# Altium schematic sheet Bang-Bang滞回控制.SchDoc
size 1651 x 1651 mm; SheetNumber: 9; SheetTotal: 16
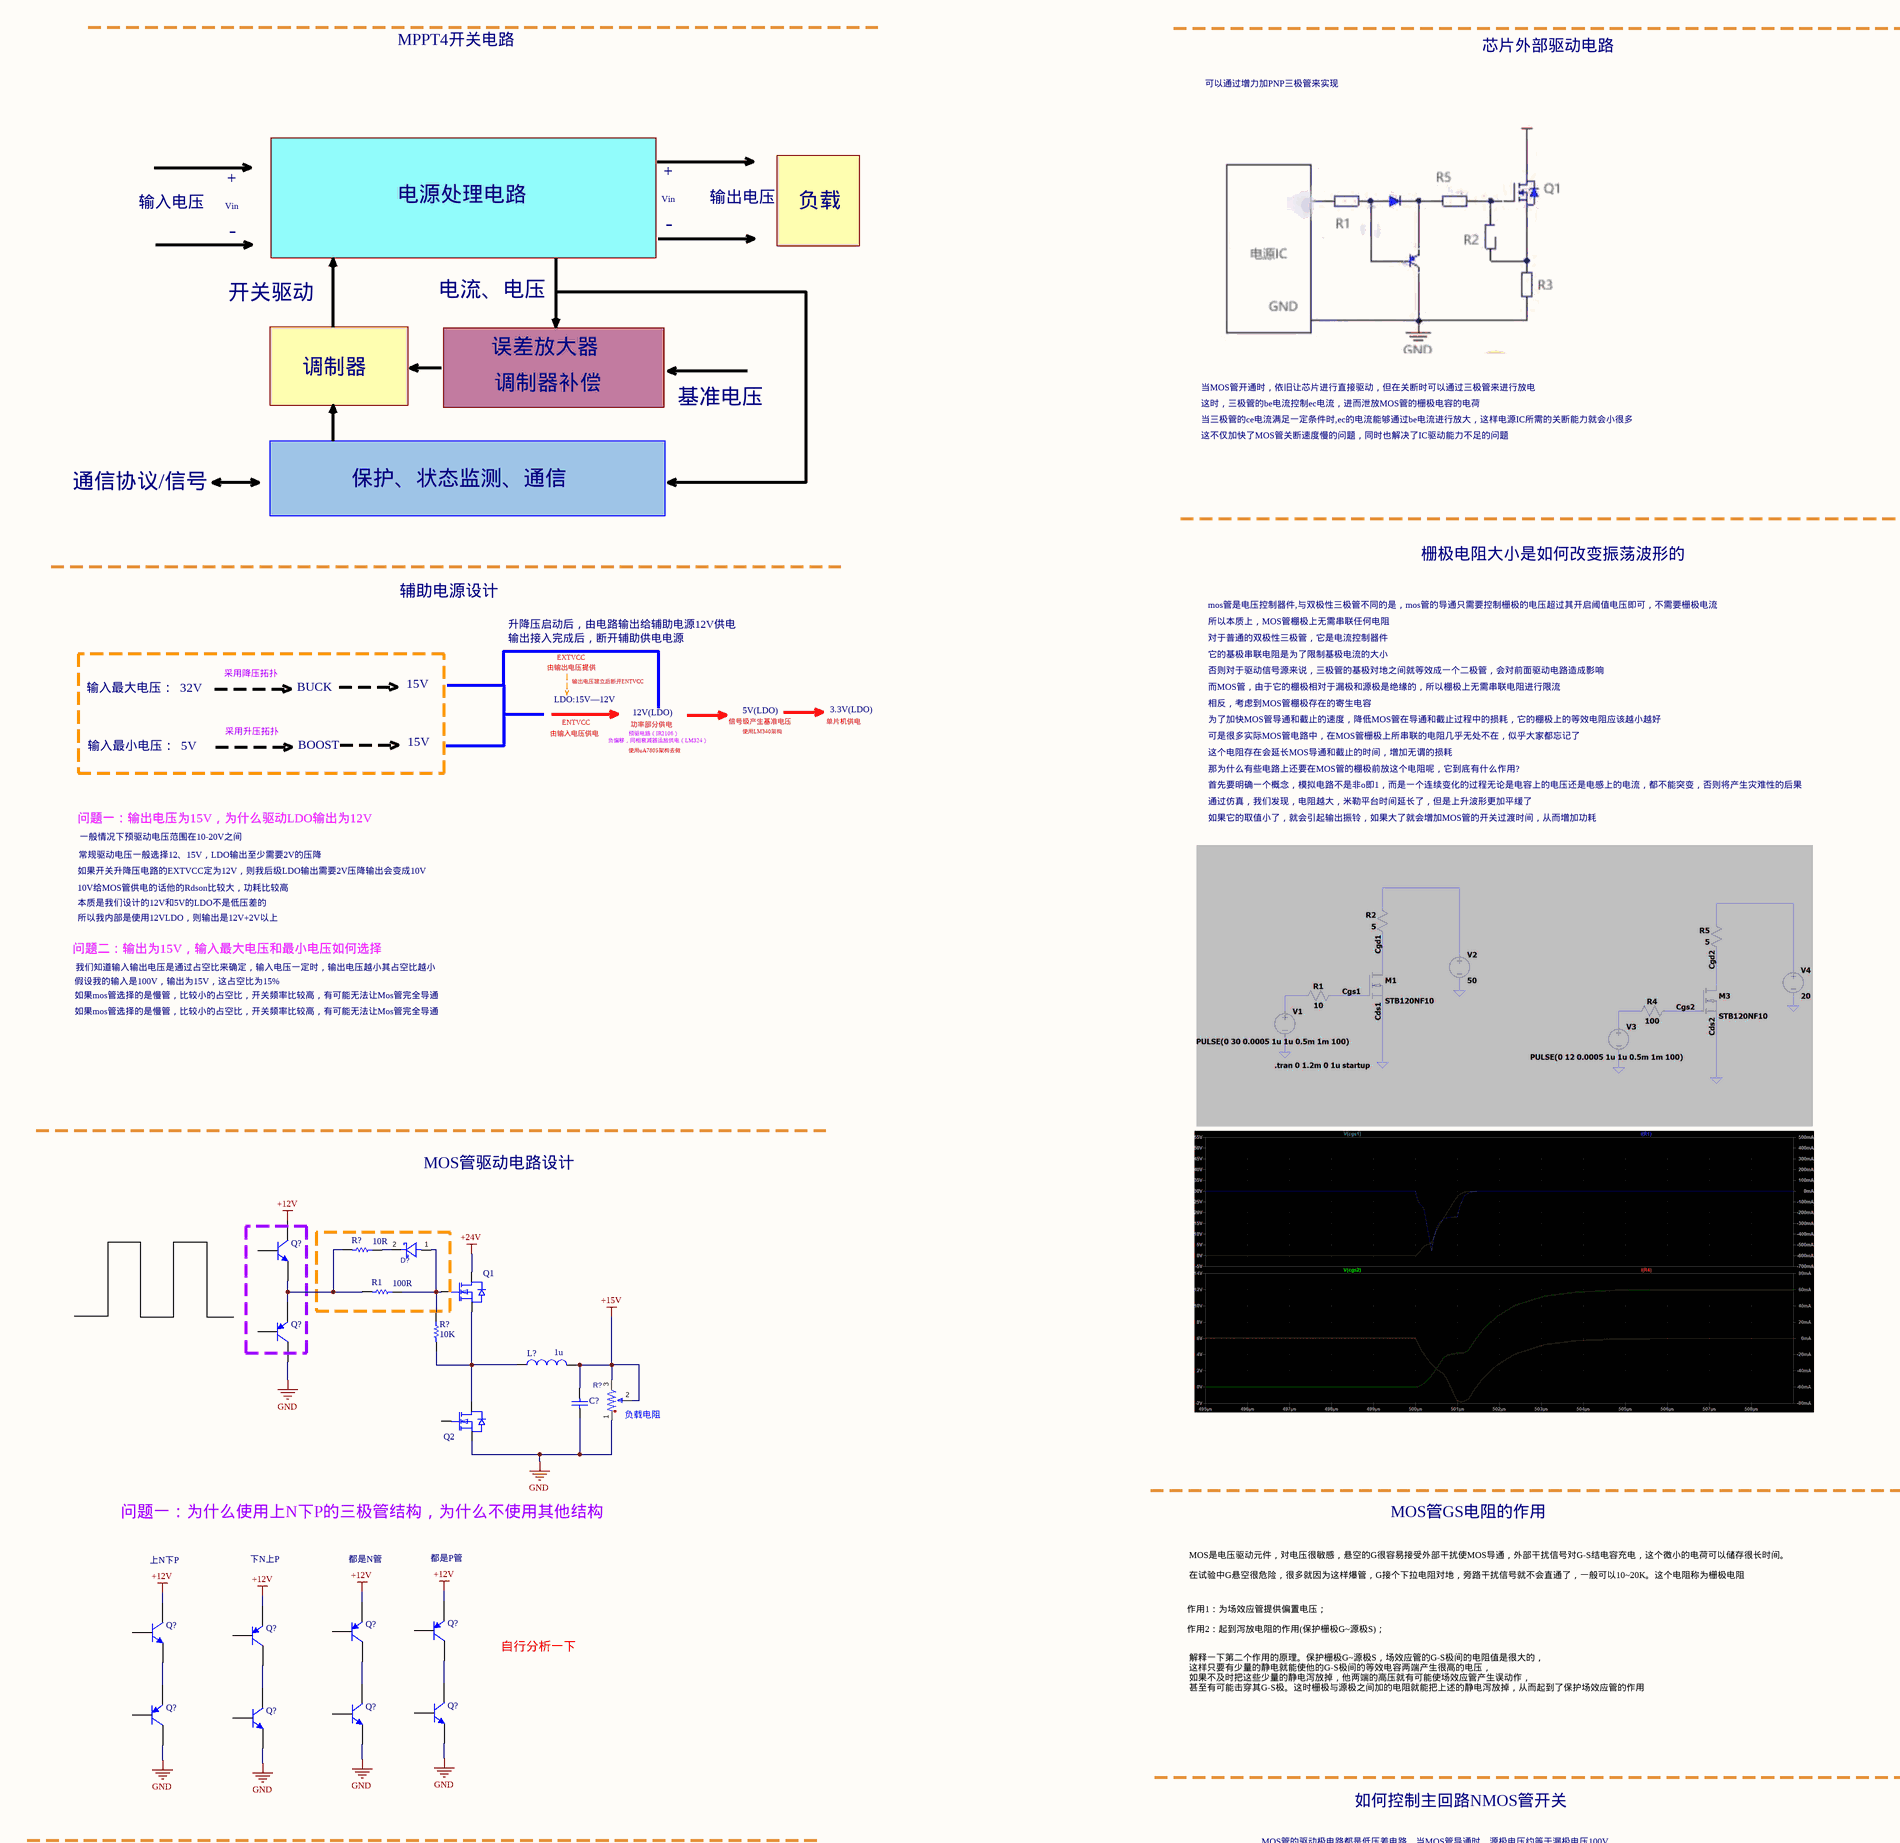
[diagram p0: Bang-Bang滞回控制.SchDoc, top left]
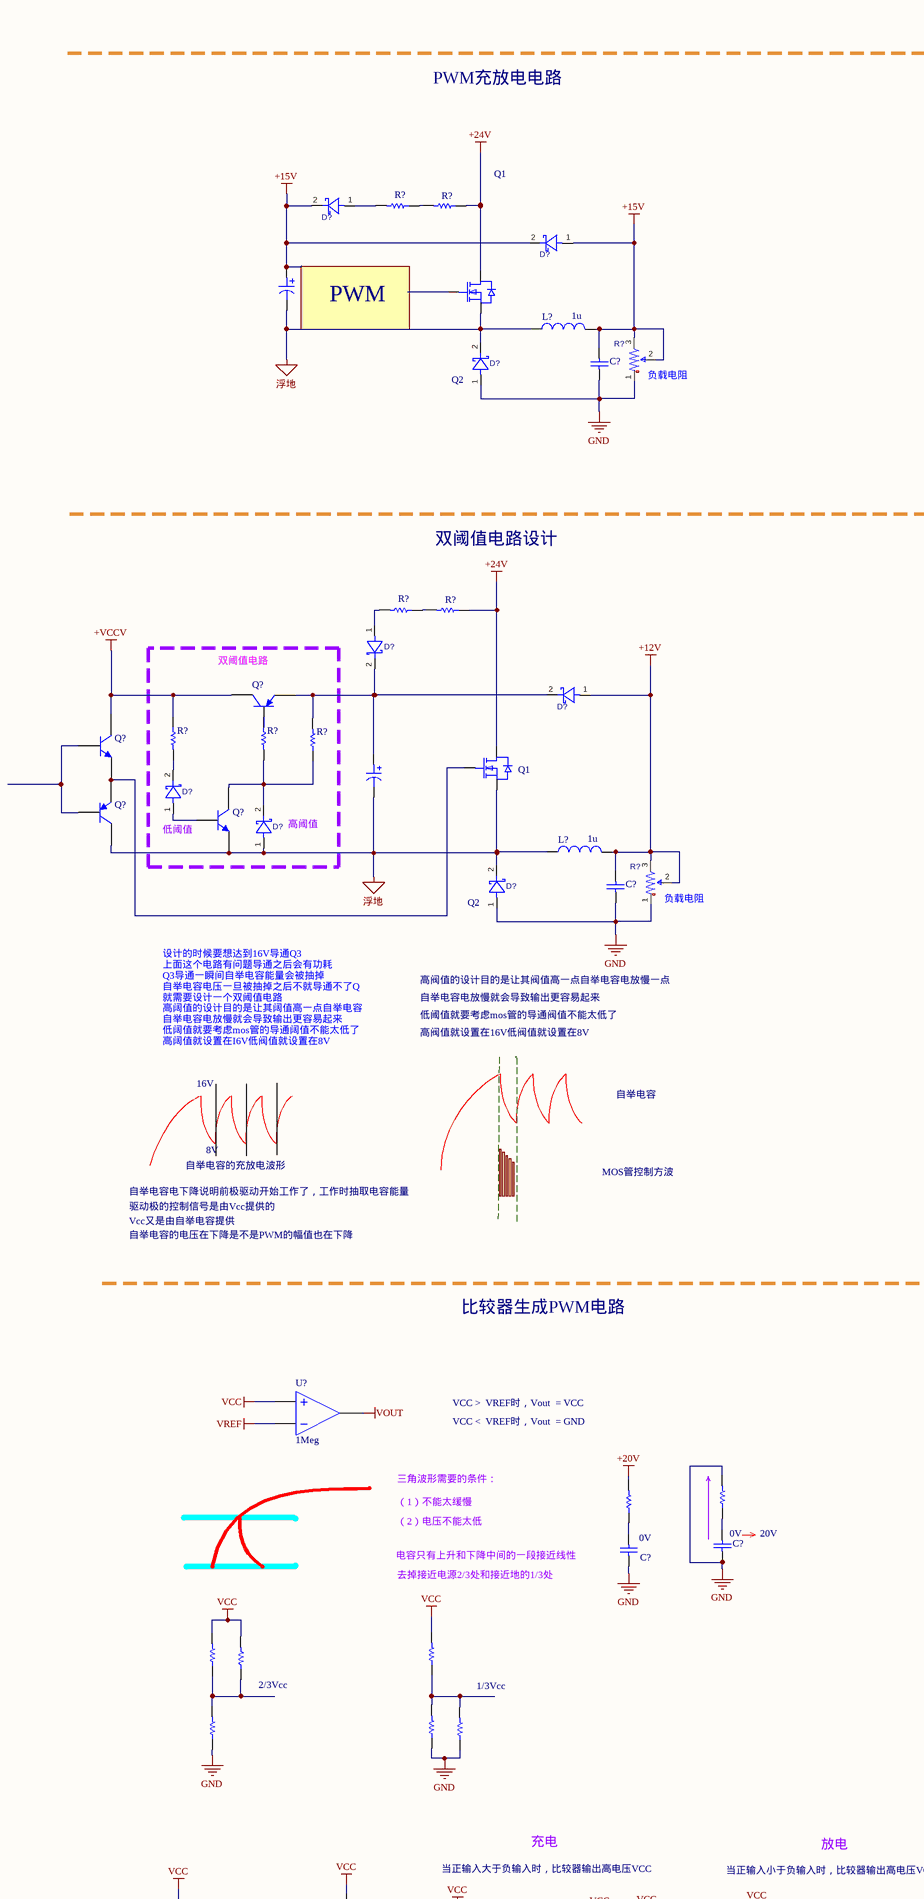
[diagram p1: Bang-Bang滞回控制.SchDoc, top middle]
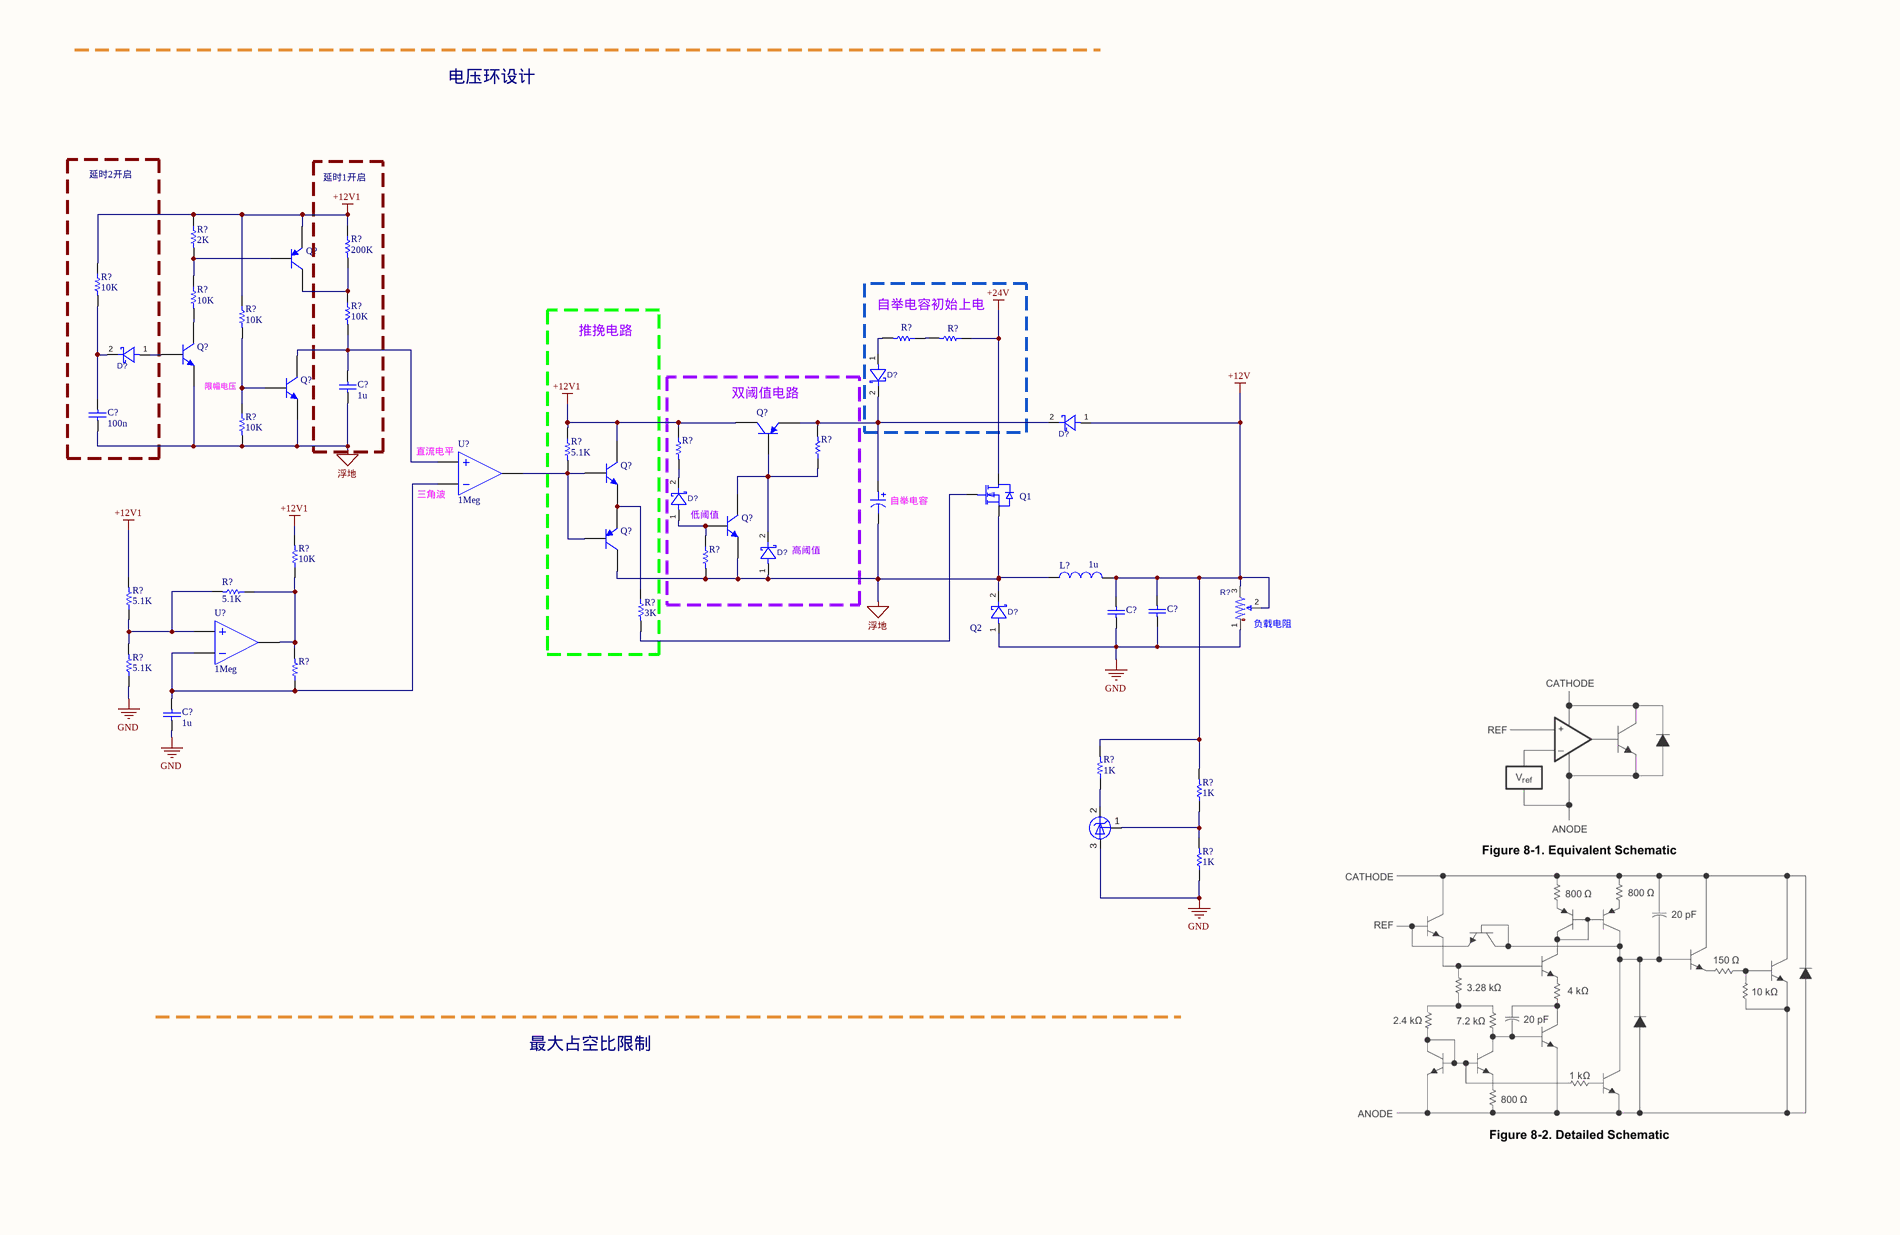
[diagram p2: Bang-Bang滞回控制.SchDoc, top right]
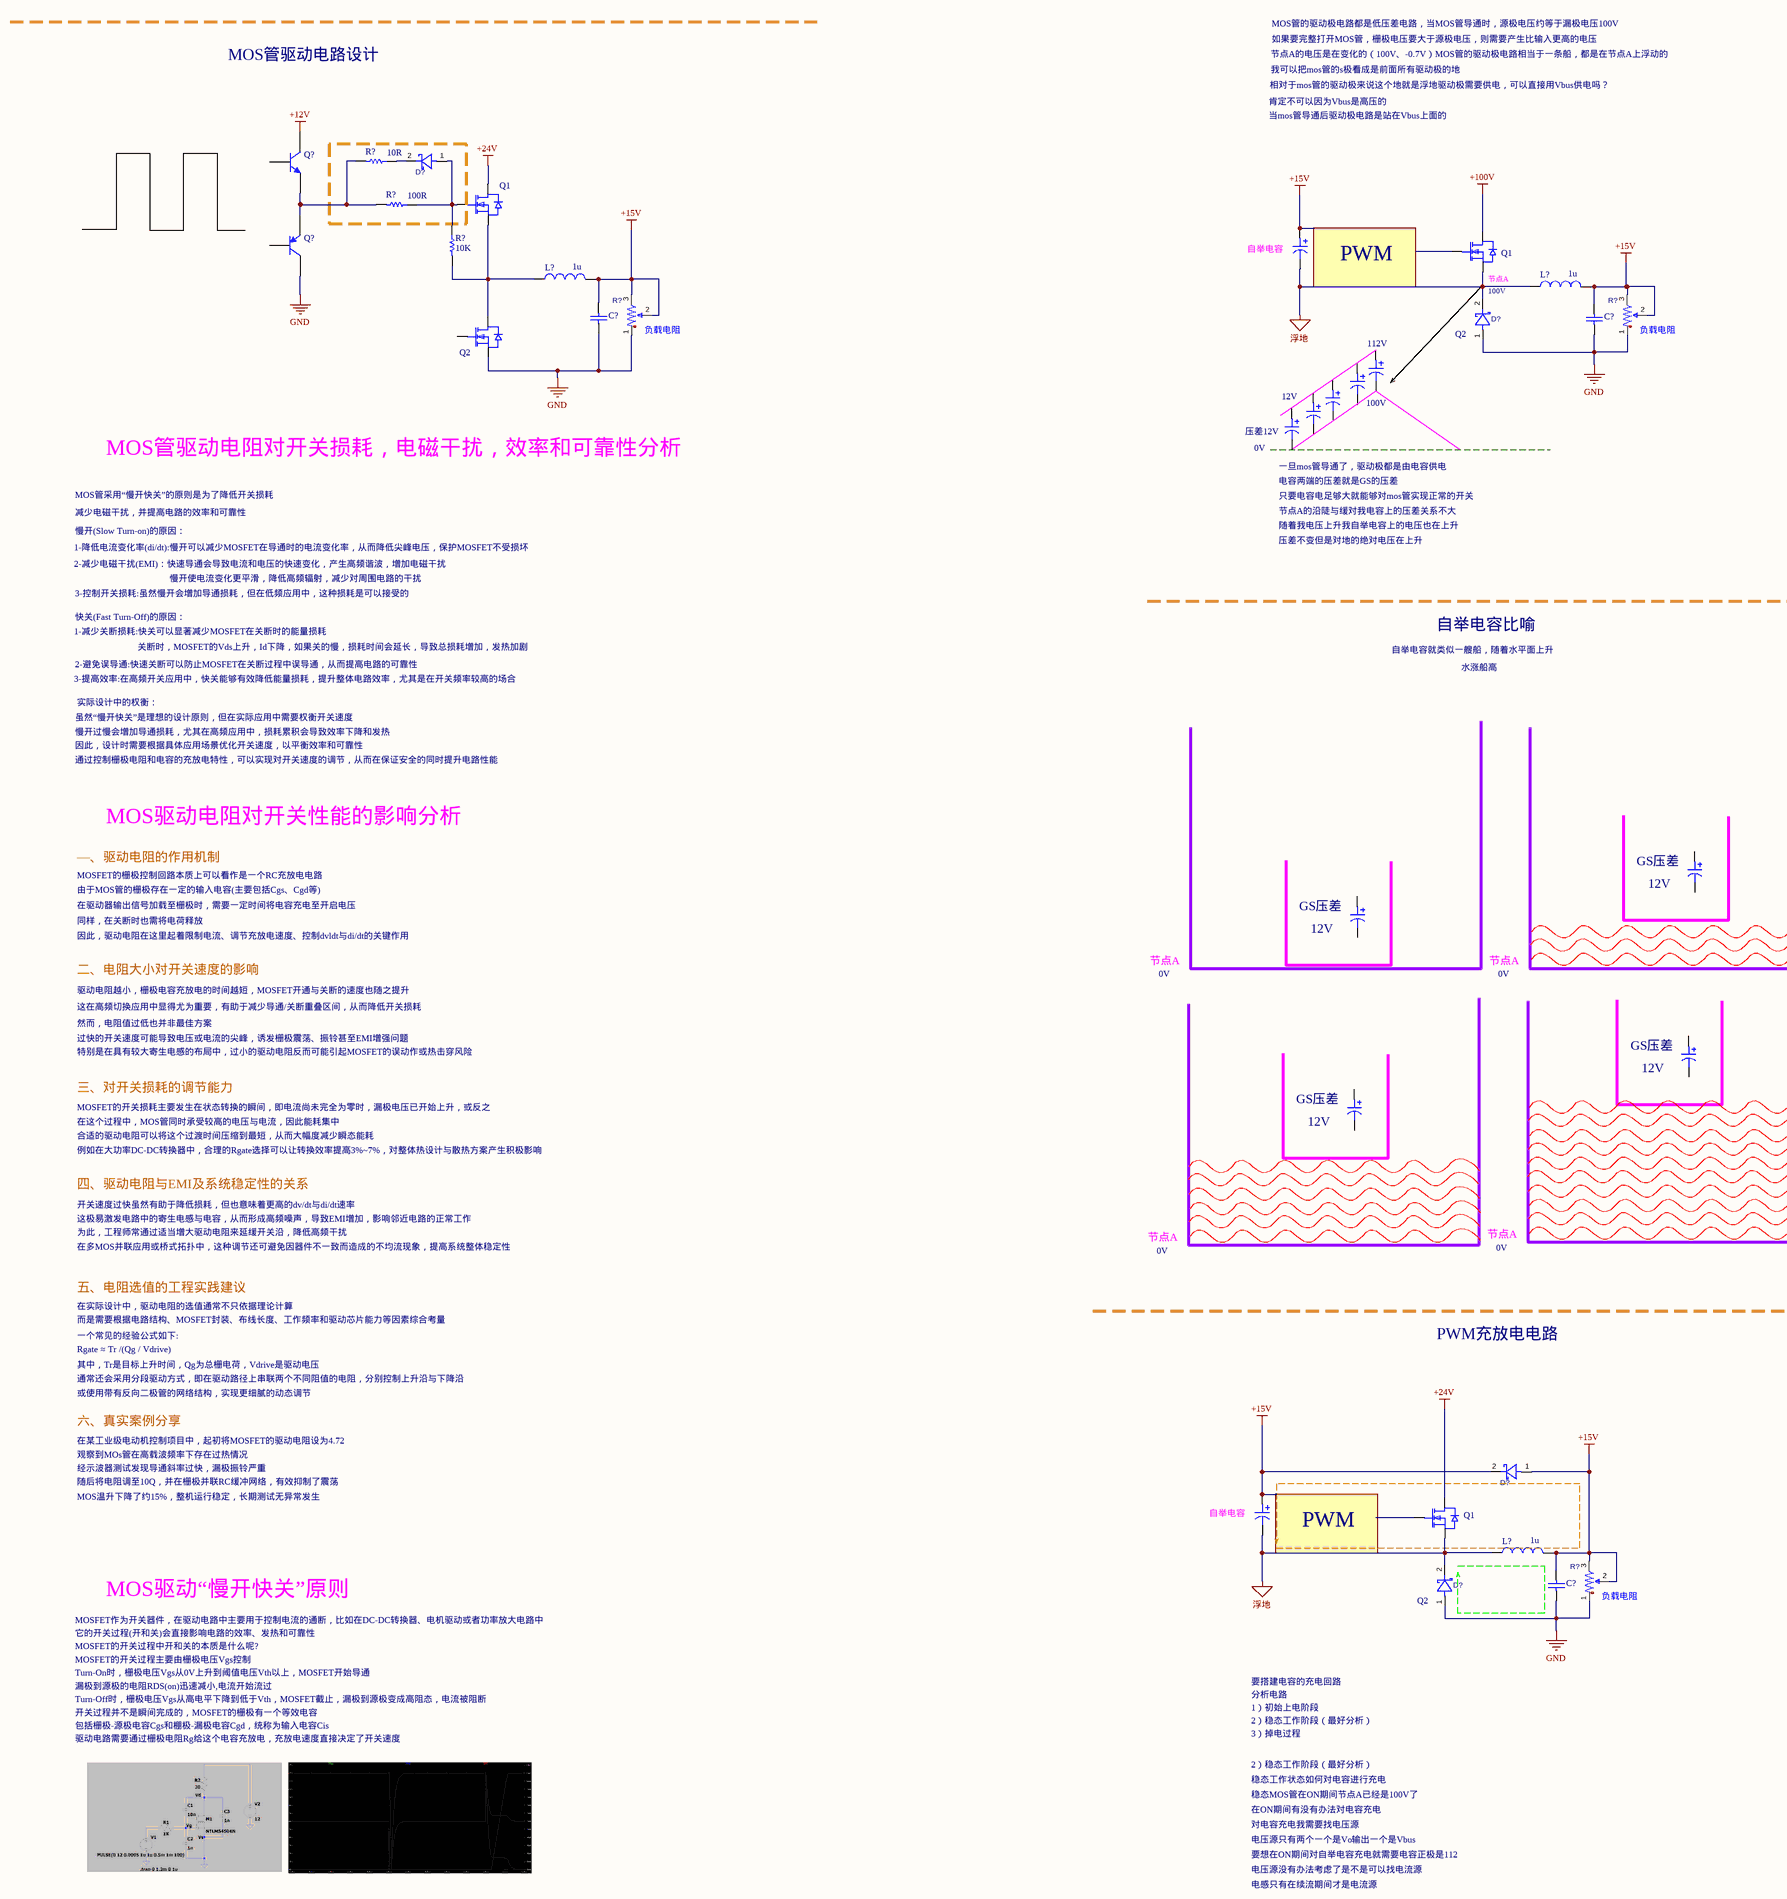
[diagram p3: Bang-Bang滞回控制.SchDoc, centre left]
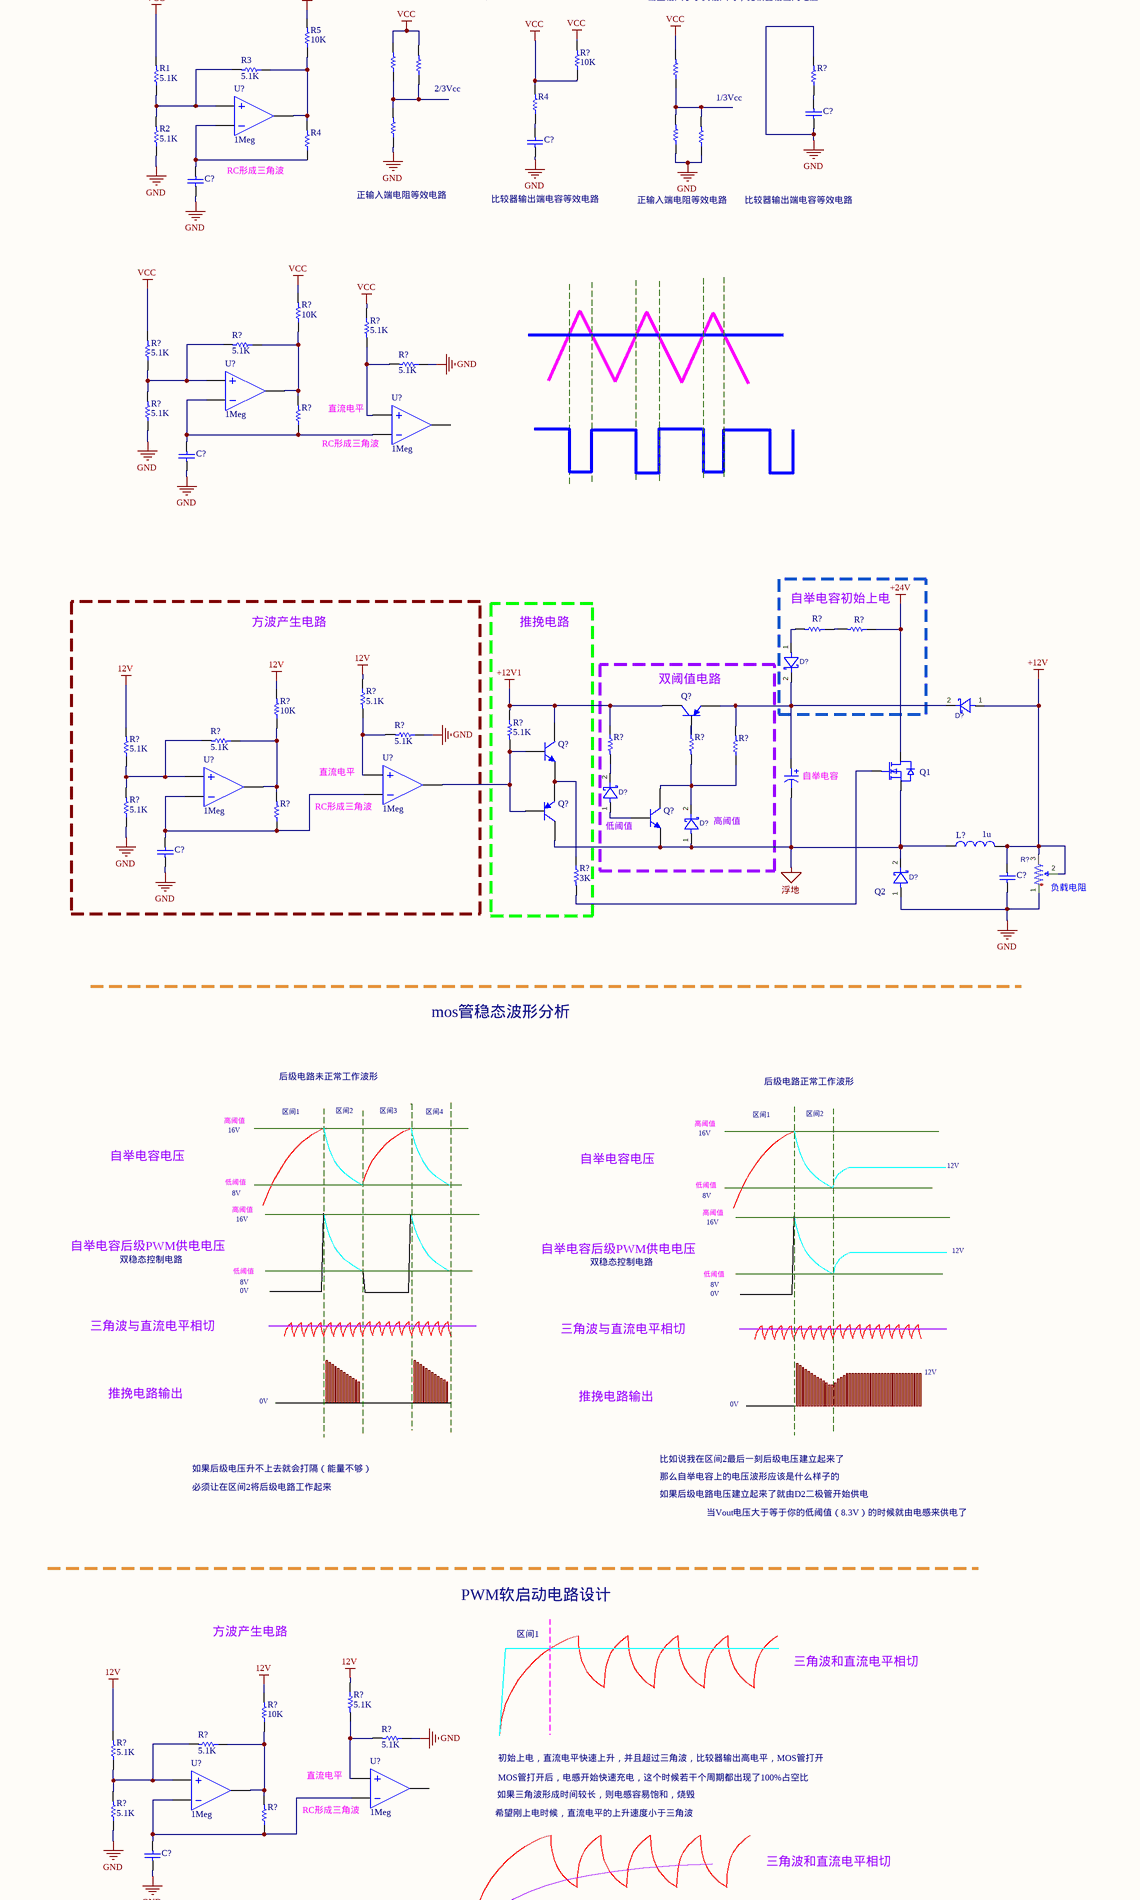
[diagram p4: Bang-Bang滞回控制.SchDoc, centre middle]
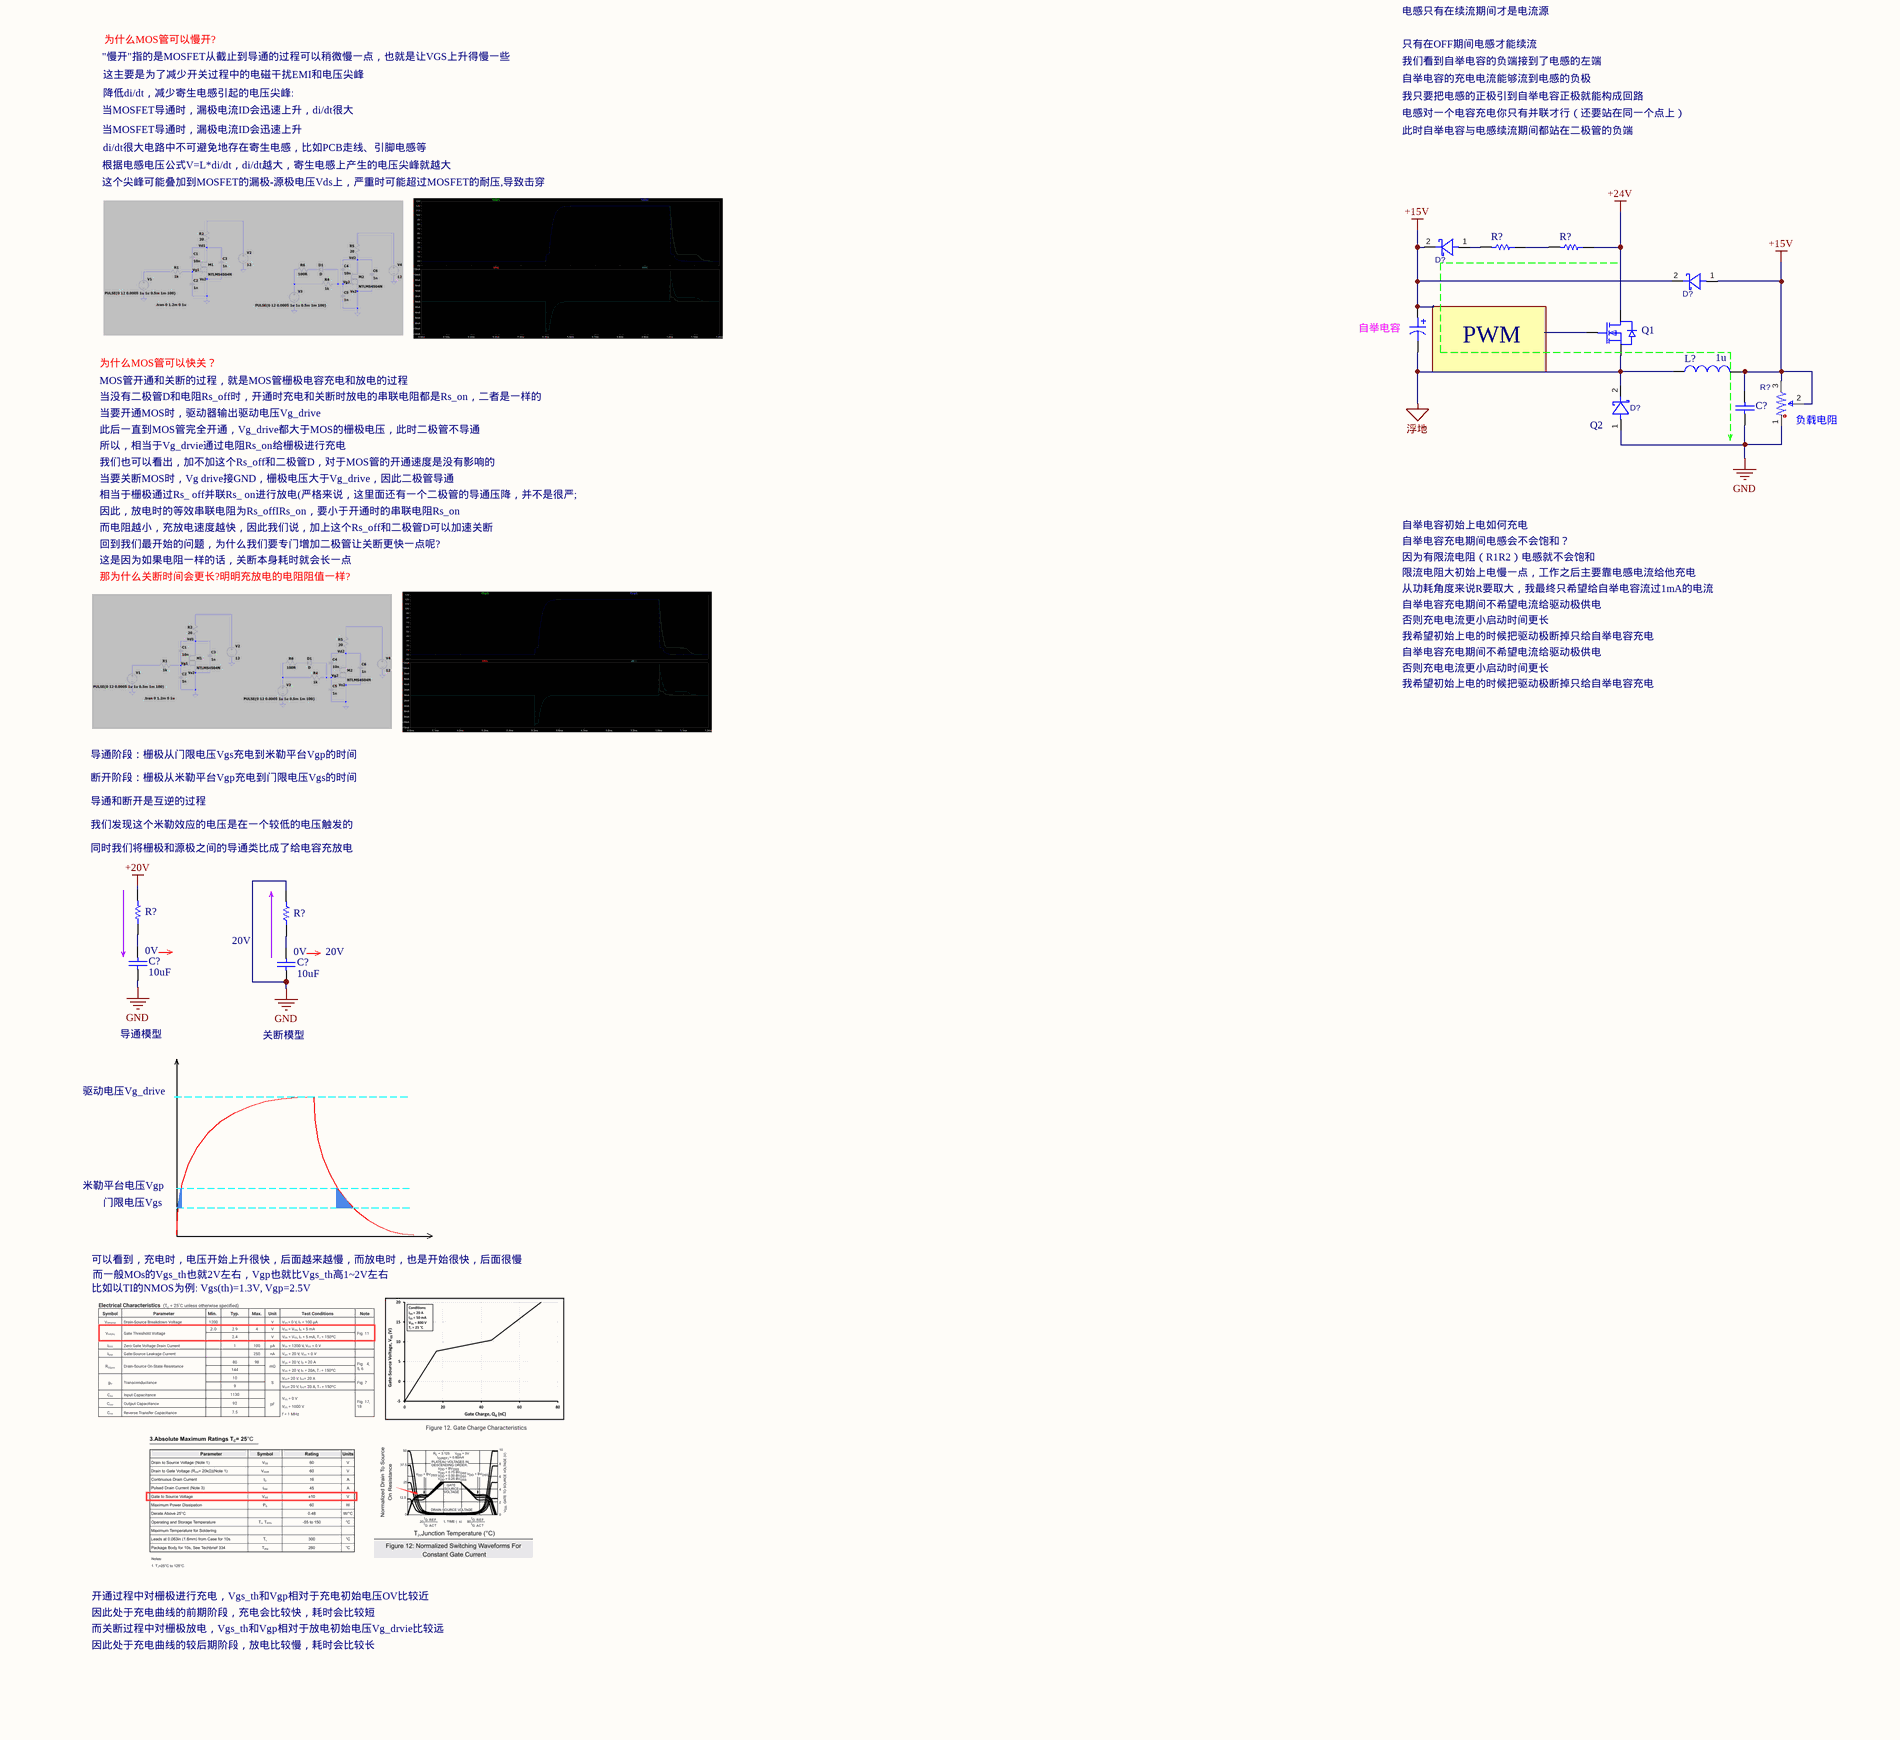
[diagram p5: Bang-Bang滞回控制.SchDoc, bottom left]
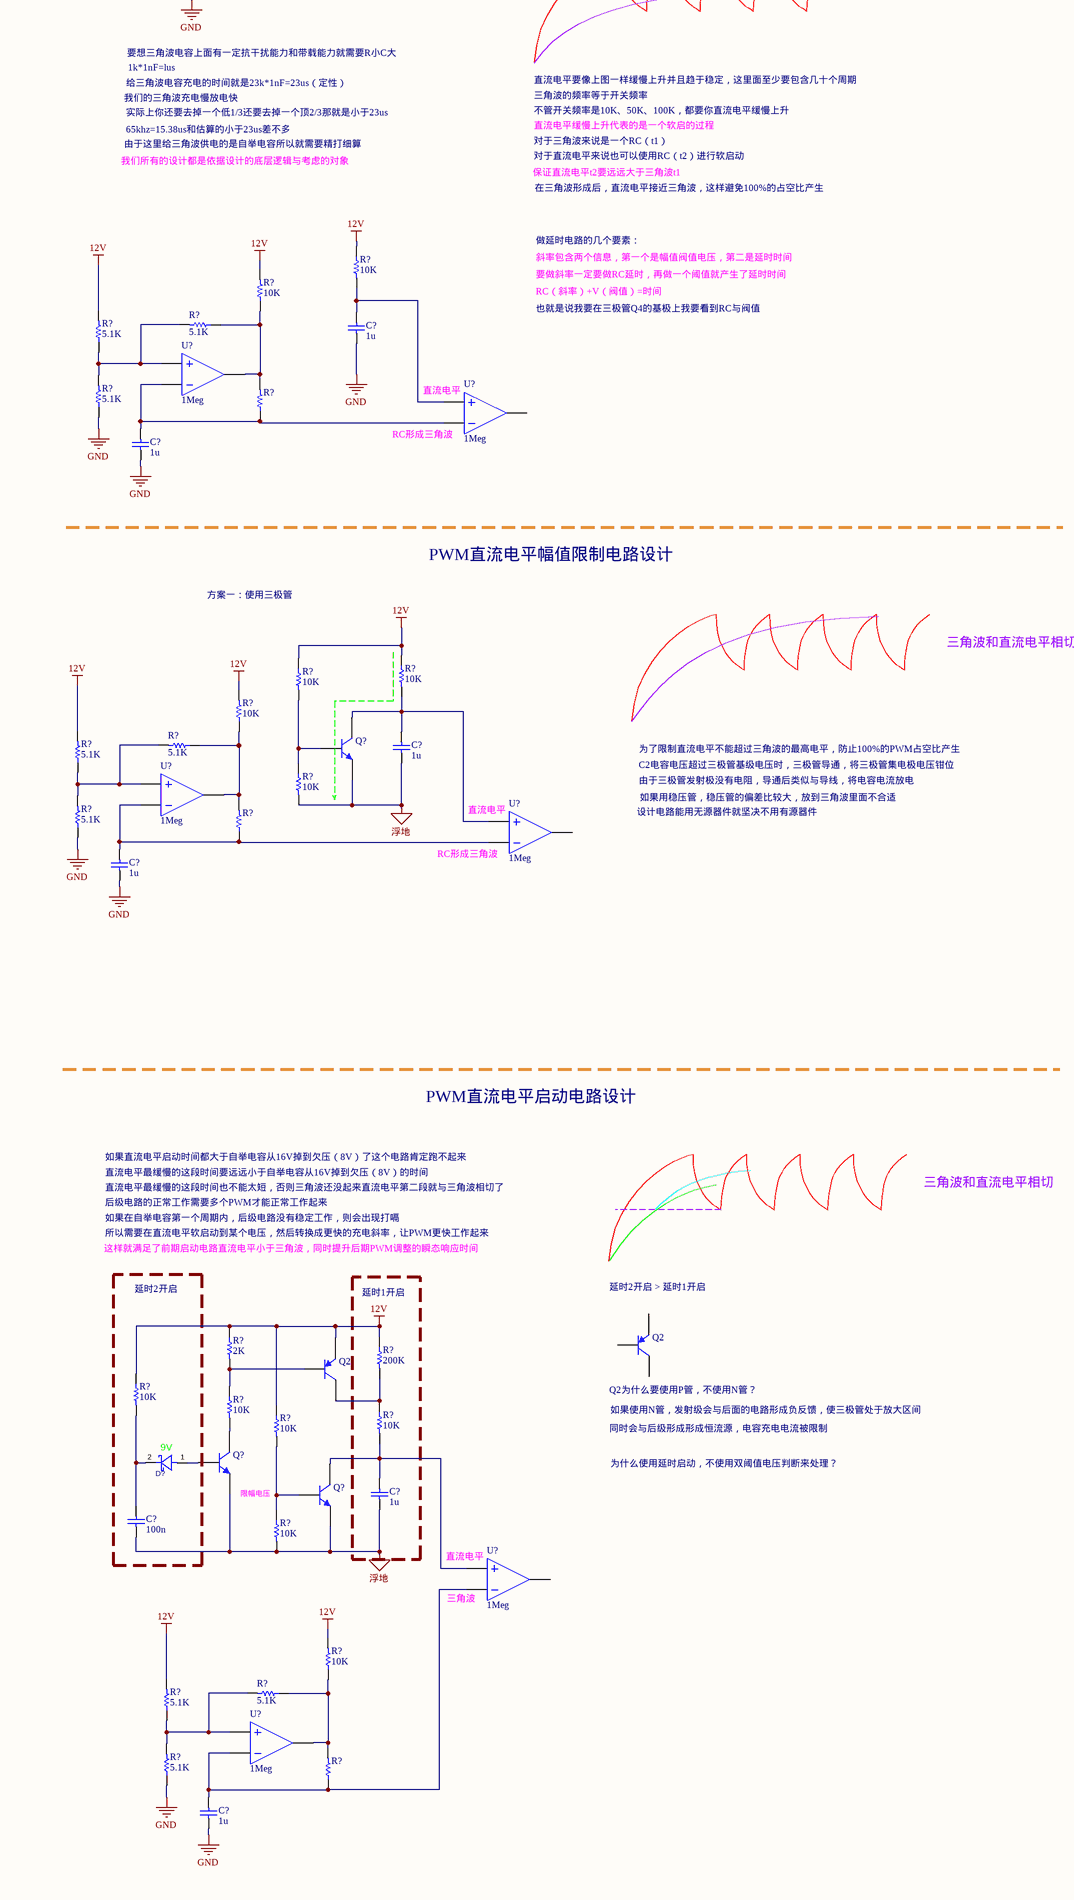
[diagram p6: Bang-Bang滞回控制.SchDoc, bottom middle]

## Parts
(Parts that share a designator on the sheet are numbered #1, #2 ... from top to bottom, then left to right.)
C?#1  JVJ50V100M6X8  (value not drawn)
C?#2  Capacitor  (value not drawn)
C?#3  value 1u  (hidden comment: Capacitor)
C?#4  value 100n  (hidden comment: Capacitor)
C?#5  JVJ50V100M6X8  (value not drawn)
C?#6  Capacitor  (value not drawn)
C?#7  Capacitor  (value not drawn)
C?#8  value 1u  (hidden comment: Capacitor)
C?#9  JVJ50V100M6X8  (value not drawn)
C?#10  Capacitor  (value not drawn)
C?#11  Capacitor  (value not drawn)
C?#12  Capacitor  (value not drawn)
C?#13  Capacitor  (value not drawn)
C?#14  Capacitor  (value not drawn)
C?#15  Capacitor  (value not drawn)
C?#16  Capacitor  (value not drawn)
C?#17  JVJ50V100M6X8  (value not drawn)
C?#18  Capacitor  (value not drawn)
C?#19  Capacitor  (value not drawn)
C?#20  JVJ50V100M6X8  (value not drawn)
C?#21  JVJ50V100M6X8  (value not drawn)
C?#22  JVJ50V100M6X8  (value not drawn)
C?#23  JVJ50V100M6X8  (value not drawn)
C?#24  Capacitor  (value not drawn)
C?#25  JVJ50V100M6X8  (value not drawn)
C?#26  JVJ50V100M6X8  (value not drawn)
C?#27  Capacitor  (value not drawn)
C?#28  Capacitor  (value not drawn)
C?#29  JVJ50V100M6X8  (value not drawn)
C?#30  JVJ50V100M6X8  (value not drawn)
C?#31  JVJ50V100M6X8  (value not drawn)
C?#32  JVJ50V100M6X8  (value not drawn)
C?#33  JVJ50V100M6X8  (value not drawn)
C?#34  Capacitor  (value not drawn)
C?#35  Capacitor  (value not drawn)
C?#36  JVJ50V100M6X8  (value not drawn)
C?#37  value 1u  (hidden comment: Capacitor)
C?#38  Capacitor  (value not drawn)
C?#39  value 1u  (hidden comment: Capacitor)
C?#40  value 1u  (hidden comment: Capacitor)
C?#41  value 1u  (hidden comment: Capacitor)
C?#42  value 10uF  (hidden comment: Capacitor)
C?#43  value 10uF  (hidden comment: Capacitor)
C?#44  value 1u  (hidden comment: Capacitor)
C?#45  value 100n  (hidden comment: Capacitor)
C?#46  value 1u  (hidden comment: Capacitor)
D?#1  15V  (value not drawn)
D?#2  15V  (value not drawn)
D?#3  15V  (value not drawn)
D?#4  15V  (value not drawn)
D?#5  15V  (value not drawn)
D?#6  15V  (value not drawn)
D?#7  15V  (value not drawn)
D?#8  15V  (value not drawn)
D?#9  15V  (value not drawn)
D?#10  15V  (value not drawn)
D?#11  15V  (value not drawn)
D?#12  15V  (value not drawn)
D?#13  15V  (value not drawn)
D?#14  15V  (value not drawn)
D?#15  15V  (value not drawn)
D?#16  15V  (value not drawn)
D?#17  15V  (value not drawn)
D?#18  15V  (value not drawn)
D?#19  15V  (value not drawn)
D?#20  15V  (value not drawn)
D?#21  15V  (value not drawn)
D?#22  15V  (value not drawn)
D?#23  15V  (value not drawn)
D?#24  15V  (value not drawn)
D?#25  15V  (value not drawn)
D?#26  15V  (value not drawn)
D?#27  15V  (value not drawn)
D?#28  9V
ESR?#1  Resistor  (value not drawn)
ESR?#2  Resistor  (value not drawn)
ESR?#3  Resistor  (value not drawn)
ESR?#4  Resistor  (value not drawn)
ESR?#5  Resistor  (value not drawn)
ESR?#6  Resistor  (value not drawn)
ESR?#7  Resistor  (value not drawn)
ESR?#8  Resistor  (value not drawn)
ESR?#9  Resistor  (value not drawn)
ESR?#10  Resistor  (value not drawn)
ESR?#11  Resistor  (value not drawn)
ESR?#12  Resistor  (value not drawn)
ESR?#13  Resistor  (value not drawn)
ESR?#14  Resistor  (value not drawn)
L?#1  value 1u  (hidden comment: Inductor)
L?#2  value 1u  (hidden comment: Inductor)
L?#3  value 1u  (hidden comment: Inductor)
L?#4  value 1u  (hidden comment: Inductor)
L?#5  value 1u  (hidden comment: Inductor)
L?#6  value 1u  (hidden comment: Inductor)
L?#7  value 1u  (hidden comment: Inductor)
L?#8  value 1u  (hidden comment: Inductor)
L?#9  value 1u  (hidden comment: Inductor)
Q2#1  Bipolar PNP 3 Pins Transistor Gummel-Poon Model  (value not drawn)
Q2#2  Bipolar PNP 3 Pins Transistor Gummel-Poon Model  (value not drawn)
Q?#1  Bipolar PNP 3 Pins Transistor Gummel-Poon Model  (value not drawn)
Q?#2  2N7002,215  (value not drawn)
Q?#3  Bipolar NPN 3 Pins Transistor VBIC Model  (value not drawn)
Q?#4  Bipolar NPN 3 Pins Transistor VBIC Model  (value not drawn)
Q?#5  Bipolar PNP 3 Pins Transistor Gummel-Poon Model  (value not drawn)
Q?#6  Bipolar NPN 3 Pins Transistor VBIC Model  (value not drawn)
Q?#7  2N7002,215  (value not drawn)
Q?#8  Bipolar NPN 3 Pins Transistor VBIC Model  (value not drawn)
Q?#9  Bipolar PNP 3 Pins Transistor Gummel-Poon Model  (value not drawn)
Q?#10  Bipolar PNP 3 Pins Transistor Gummel-Poon Model  (value not drawn)
Q?#11  Bipolar NPN 3 Pins Transistor VBIC Model  (value not drawn)
Q?#12  2N7002,215  (value not drawn)
Q?#13  Bipolar PNP 3 Pins Transistor Gummel-Poon Model  (value not drawn)
Q?#14  Bipolar NPN 3 Pins Transistor VBIC Model  (value not drawn)
Q?#15  Bipolar NPN 3 Pins Transistor VBIC Model  (value not drawn)
Q?#16  2N7002,215  (value not drawn)
Q?#17  Bipolar PNP 3 Pins Transistor Gummel-Poon Model  (value not drawn)
Q?#18  2N7002,215  (value not drawn)
Q?#19  Bipolar PNP 3 Pins Transistor Gummel-Poon Model  (value not drawn)
Q?#20  Bipolar PNP 3 Pins Transistor Gummel-Poon Model  (value not drawn)
Q?#21  Bipolar NPN 3 Pins Transistor VBIC Model  (value not drawn)
Q?#22  Bipolar PNP 3 Pins Transistor Gummel-Poon Model  (value not drawn)
Q?#23  Bipolar PNP 3 Pins Transistor Gummel-Poon Model  (value not drawn)
Q?#24  Bipolar NPN 3 Pins Transistor VBIC Model  (value not drawn)
Q?#25  Bipolar NPN 3 Pins Transistor VBIC Model  (value not drawn)
Q?#26  Bipolar NPN 3 Pins Transistor VBIC Model  (value not drawn)
Q?#27  Bipolar NPN 3 Pins Transistor VBIC Model  (value not drawn)
Q?#28  2N7002,215  (value not drawn)
Q?#29  Bipolar PNP 3 Pins Transistor Gummel-Poon Model  (value not drawn)
Q?#30  2N7002,215  (value not drawn)
Q?#31  2N7002,215  (value not drawn)
Q?#32  Bipolar PNP 3 Pins Transistor Gummel-Poon Model  (value not drawn)
Q?#33  Bipolar NPN 3 Pins Transistor VBIC Model  (value not drawn)
Q?#34  2N7002,215  (value not drawn)
Q?#35  Bipolar PNP 3 Pins Transistor Gummel-Poon Model  (value not drawn)
Q?#36  Bipolar NPN 3 Pins Transistor VBIC Model  (value not drawn)
Q?#37  2N7002,215  (value not drawn)
Q?#38  2N7002,215  (value not drawn)
Q?#39  Bipolar NPN 3 Pins Transistor VBIC Model  (value not drawn)
Q?#40  Bipolar NPN 3 Pins Transistor VBIC Model  (value not drawn)
Q?#41  Bipolar NPN 3 Pins Transistor VBIC Model  (value not drawn)
R1#1  100R
R1#2  value 5.1K  (hidden comment: Resistor)
R2  value 5.1K  (hidden comment: Resistor)
R3  value 5.1K  (hidden comment: Resistor)
R4#1  Resistor  (value not drawn)
R4#2  Resistor  (value not drawn)
R5  value 10K  (hidden comment: Resistor)
R?#1  Resistor  (value not drawn)
R?#2  Resistor  (value not drawn)
R?#3  value 2K  (hidden comment: Resistor)
R?#4  value 200K  (hidden comment: Resistor)
R?#5  value 10K  (hidden comment: Resistor)
R?#6  value 10K  (hidden comment: Resistor)
R?#7  value 10K  (hidden comment: Resistor)
R?#8  value 10K  (hidden comment: Resistor)
R?#9  Resistor  (value not drawn)
R?#10  Resistor  (value not drawn)
R?#11  负载电阻
R?#12  value 10K  (hidden comment: Resistor)
R?#13  value 5.1K  (hidden comment: Resistor)
R?#14  Resistor  (value not drawn)
R?#15  Resistor  (value not drawn)
R?#16  Resistor  (value not drawn)
R?#17  value 10K  (hidden comment: Resistor)
R?#18  value 5.1K  (hidden comment: Resistor)
R?#19  value 3K  (hidden comment: Resistor)
R?#20  Resistor  (value not drawn)
R?#21  Resistor  (value not drawn)
R?#22  负载电阻
R?#23  value 5.1K  (hidden comment: Resistor)
R?#24  value 5.1K  (hidden comment: Resistor)
R?#25  Resistor  (value not drawn)
R?#26  Resistor  (value not drawn)
R?#27  Resistor  (value not drawn)
R?#28  Resistor  (value not drawn)
R?#29  value 1K  (hidden comment: Resistor)
R?#30  value 1K  (hidden comment: Resistor)
R?#31  负载电阻
R?#32  value 1K  (hidden comment: Resistor)
R?#33  10R
R?#34  10K
R?#35  负载电阻
R?#36  value 10K  (hidden comment: Resistor)
R?#37  Resistor  (value not drawn)
R?#38  10R
R?#39  100R
R?#40  10K
R?#41  value 5.1K  (hidden comment: Resistor)
R?#42  value 10K  (hidden comment: Resistor)
R?#43  value 5.1K  (hidden comment: Resistor)
R?#44  value 5.1K  (hidden comment: Resistor)
R?#45  value 5.1K  (hidden comment: Resistor)
R?#46  负载电阻
R?#47  负载电阻
R?#48  value 5.1K  (hidden comment: Resistor)
R?#49  Resistor  (value not drawn)
R?#50  Resistor  (value not drawn)
R?#51  Resistor  (value not drawn)
R?#52  value 5.1K  (hidden comment: Resistor)
R?#53  value 5.1K  (hidden comment: Resistor)
R?#54  Resistor  (value not drawn)
R?#55  Resistor  (value not drawn)
R?#56  value 10K  (hidden comment: Resistor)
R?#57  value 5.1K  (hidden comment: Resistor)
R?#58  value 5.1K  (hidden comment: Resistor)
R?#59  value 5.1K  (hidden comment: Resistor)
R?#60  Resistor  (value not drawn)
R?#61  value 5.1K  (hidden comment: Resistor)
R?#62  Resistor  (value not drawn)
R?#63  value 3K  (hidden comment: Resistor)
R?#64  负载电阻
R?#65  负载电阻
R?#66  value 5.1K  (hidden comment: Resistor)
R?#67  value 10K  (hidden comment: Resistor)
R?#68  value 5.1K  (hidden comment: Resistor)
R?#69  value 5.1K  (hidden comment: Resistor)
R?#70  value 5.1K  (hidden comment: Resistor)
R?#71  value 5.1K  (hidden comment: Resistor)
R?#72  Resistor  (value not drawn)
R?#73  100R  (value not drawn)
R?#74  100R  (value not drawn)
R?#75  value 10K  (hidden comment: Resistor)
R?#76  value 10K  (hidden comment: Resistor)
R?#77  value 5.1K  (hidden comment: Resistor)
R?#78  负载电阻
R?#79  value 5.1K  (hidden comment: Resistor)
R?#80  value 5.1K  (hidden comment: Resistor)
R?#81  Resistor  (value not drawn)
R?#82  value 10K  (hidden comment: Resistor)
R?#83  value 10K  (hidden comment: Resistor)
R?#84  value 10K  (hidden comment: Resistor)
R?#85  value 5.1K  (hidden comment: Resistor)
R?#86  value 10K  (hidden comment: Resistor)
R?#87  value 5.1K  (hidden comment: Resistor)
R?#88  value 5.1K  (hidden comment: Resistor)
R?#89  Resistor  (value not drawn)
R?#90  Resistor  (value not drawn)
R?#91  Resistor  (value not drawn)
R?#92  value 2K  (hidden comment: Resistor)
R?#93  value 200K  (hidden comment: Resistor)
R?#94  value 10K  (hidden comment: Resistor)
R?#95  value 10K  (hidden comment: Resistor)
R?#96  value 10K  (hidden comment: Resistor)
R?#97  value 10K  (hidden comment: Resistor)
R?#98  value 10K  (hidden comment: Resistor)
R?#99  value 10K  (hidden comment: Resistor)
R?#100  value 5.1K  (hidden comment: Resistor)
R?#101  value 5.1K  (hidden comment: Resistor)
R?#102  value 5.1K  (hidden comment: Resistor)
R?#103  Resistor  (value not drawn)
U?#1  GAIN: 1Meg  (hidden comment: Ideal Operational Amplifier)
U?#2  GAIN: 1Meg  (hidden comment: Ideal Operational Amplifier)
U?#3  GAIN: 1Meg  (hidden comment: Ideal Operational Amplifier)
U?#4  GAIN: 1Meg  (hidden comment: Ideal Operational Amplifier)
U?#5  GAIN: 1Meg  (hidden comment: Ideal Operational Amplifier)
U?#6  GAIN: 1Meg  (hidden comment: Ideal Operational Amplifier)
U?#7  GAIN: 1Meg  (hidden comment: Ideal Operational Amplifier)
U?#8  GAIN: 1Meg  (hidden comment: Ideal Operational Amplifier)
U?#9  GAIN: 1Meg  (hidden comment: Ideal Operational Amplifier)
U?#10  GAIN: 1Meg  (hidden comment: Ideal Operational Amplifier)
U?#11  GAIN: 1Meg  (hidden comment: Ideal Operational Amplifier)
U?#12  GAIN: 1Meg  (hidden comment: Ideal Operational Amplifier)
U?#13  GAIN: 1Meg  (hidden comment: Ideal Operational Amplifier)
U?#14  GAIN: 1Meg  (hidden comment: Ideal Operational Amplifier)
U?#15  GAIN: 1Meg  (hidden comment: Ideal Operational Amplifier)
U?#16  GAIN: 1Meg  (hidden comment: Ideal Operational Amplifier)
U??  tl431a_c54830631  [SOT-23-3_L3.0-W1.7-P0.95-LS2.9-BR]  (value not drawn)

## Blocks framed on the sheet
延时2开启: C?#4 D?#3 R?#5
延时1开启: C?#3 R?#4 R?#8
自举电容初始上电: D?#5 R?#9 R?#10
推挽电路: Q?#6 Q?#9 R?#13 R?#19
双阈值电路: D?#7 D?#8 Q?#5 Q?#8 R?#14-R?#16
自举电容初始上电: D?#18 R?#50 R?#51
方波产生电路: C?#27 R?#52 R?#56-R?#59 R?#61 R?#62 U?#7 U?#8
推挽电路: Q?#33 Q?#35 R?#53 R?#63
双阈值电路: D?#20 D?#21 Q?#32 Q?#36 R?#54 R?#55 R?#60
延时2开启: C?#45 D?#28 R?#94
延时1开启: C?#44 R?#93 R?#97

## Nets
12V: Q2#2.3(E) R?#52.1 R?#56.2 R?#59.2 R?#66.1 R?#67.2 R?#70.2 R?#75.1 R?#76.2 R?#79.2 R?#82.1 R?#83.1 R?#84.2 R?#87.2 R?#92.1 R?#93.1 R?#94.1 R?#96.1 R?#99.2 R?#101.2
+12V: C?#6.2 C?#7.2 C?#10.2 C?#28.2 D?#6.1(A) D?#11.1(A) D?#19.1(A) L?#2.2 L?#3.2 L?#7.2 Q?#15.1(C) Q?#19.3(E) Q?#20.3(E) Q?#21.1(C) Q?#22.3(E) Q?#27.1(C) R?#22.2 R?#22.3 R?#29.2 R?#30.2 R?#31.2 R?#31.3 R?#64.2 R?#64.3
+12V1: Q?#1.3(E) Q?#5.1(C) Q?#6.1(C) Q?#32.1(C) Q?#33.1(C) R?#3.1 R?#4.1 R?#5.1 R?#7.1 R?#13.1 R?#14.1 R?#17.2 R?#23.2 R?#53.1 R?#54.1
+15V: C?#1.1 C?#2.2 C?#11.2 C?#17.1 C?#18.2 C?#19.2 C?#33.1 C?#34.2 C?#36.1 C?#38.2 D?#1.2(K) D?#2.1(A) D?#2.2(K) D?#23.1(A) D?#23.2(K) D?#25.2(K) D?#26.1(A) D?#26.2(K) L?#1.2 L?#4.2 L?#5.2 L?#6.2 L?#8.2 L?#9.2 R?#11.2 R?#11.3 R?#35.2 R?#35.3 R?#46.2 R?#46.3 R?#47.2 R?#47.3 R?#65.2 R?#65.3 R?#78.2 R?#78.3
+20V: ESR?#1.2 R?#89.2
+24V: Q?#2.3(D) Q?#7.3(D) Q?#12.3(D) Q?#16.3(D) Q?#28.3(D) Q?#34.3(D) Q?#37.3(D) Q?#38.3(D) R?#2.1 R?#10.1 R?#21.1 R?#51.1 R?#74.1
+100V: Q?#30.3(D)
+VCCV: Q?#10.1(C) Q?#11.1(C) R?#26.1
GND: C?#2.1 C?#6.1 C?#7.1 C?#8.1 C?#10.1 C?#11.1 C?#12.1 C?#13.1 C?#14.1 C?#15.1 C?#16.1 C?#18.1 C?#19.1 C?#24.1 C?#27.1 C?#28.1 C?#34.1 C?#35.1 C?#37.1 C?#38.1 C?#39.1 C?#41.1 C?#42.1 C?#43.1 C?#46.1 D?#4.1(A) D?#9.1(A) D?#14.1(A) D?#17.1(A) D?#22.1(A) D?#24.1(A) D?#27.1(A) ESR?#2.2 ESR?#6.1 ESR?#7.1 ESR?#8.1 ESR?#12.1 ESR?#13.1 ESR?#14.1 Q?#17.1(C) Q?#18.2(S) Q?#23.1(C) Q?#24.3(E) Q?#25.3(E) Q?#26.3(E) Q?#29.1(C) Q?#31.2(S) R2.1 R?#11.1 R?#22.1 R?#24.1 R?#31.1 R?#32.1 R?#35.1 R?#37.2 R?#44.1 R?#46.1 R?#47.1 R?#48.1 R?#57.1 R?#61.1 R?#64.1 R?#65.1 R?#68.1 R?#71.1 R?#78.1 R?#80.1 R?#88.1 R?#91.2 R?#102.1 U??.3(A)
VCC: ESR?#3.2 ESR?#4.2 ESR?#5.2 ESR?#9.2 ESR?#10.2 ESR?#11.2 R1#2.2 R4#1.2 R5.2 R?#36.1 R?#36.2 R?#41.1 R?#42.2 R?#45.2 U?#3.2(IN+)
VOUT: U?#3.3(OUT)
VREF: U?#3.1(IN-)
浮地: C?#1.2 C?#3.1 C?#4.1 C?#5.2 C?#9.2 C?#17.2 C?#26.2 C?#33.2 C?#36.2 C?#40.1 C?#44.1 C?#45.1 D?#4.2(K) D?#8.1(A) D?#9.2(K) D?#13.1(A) D?#14.2(K) D?#17.2(K) D?#21.1(A) D?#22.2(K) D?#24.2(K) D?#27.2(K) L?#1.1 L?#2.1 L?#3.1 L?#6.1 L?#7.1 L?#8.1 L?#9.1 Q?#2.2(S) Q?#3.3(E) Q?#4.3(E) Q?#7.2(S) Q?#8.3(E) Q?#9.1(C) Q?#12.2(S) Q?#13.1(C) Q?#14.3(E) Q?#30.2(S) Q?#34.2(S) Q?#35.1(C) Q?#36.3(E) Q?#37.2(S) Q?#38.2(S) Q?#39.3(E) Q?#40.3(E) Q?#41.3(E) R?#12.2 R?#16.2 R?#86.2 R?#98.2
NetC?#3_2: C?#3.2 Q?#4.1(C) R?#8.2 U?#1.2(IN+)
NetC?#4_2: C?#4.2 D?#3.2(K) R?#5.2
NetC?#5_1: C?#5.1 D?#5.2(K) D?#6.2(K) Q?#5.3(E) R?#15.2
NetC?#8_2: C?#8.2 R?#25.1 U?#1.1(IN-) U?#2.1(IN-)
NetC?#9_1: C?#9.1 D?#10.2(K) D?#11.2(K) Q?#10.3(E) R?#28.2
NetC?#12_2: C?#12.2 ESR?#1.1
NetC?#13_2: C?#13.2 ESR?#2.1
NetC?#14_2: C?#14.2 R?#37.1
NetC?#15_2: C?#15.2 R4#1.1
NetC?#16_2: C?#16.2 R4#2.1 U?#4.1(IN-)
NetC?#24_2: C?#24.2 R?#49.1 U?#5.1(IN-) U?#6.1(IN-)
NetC?#26_1: C?#26.1 D?#18.2(K) D?#19.2(K) Q?#32.3(E) R?#60.2
NetC?#27_2: C?#27.2 R?#62.1 U?#7.1(IN-) U?#8.1(IN-)
NetC?#35_2: C?#35.2 R?#72.1 U?#9.1(IN-) U?#10.1(IN-)
NetC?#37_2: C?#37.2 R?#75.2 U?#12.2(IN+)
NetC?#39_2: C?#39.2 R?#81.1 U?#11.1(IN-) U?#12.1(IN-)
NetC?#40_2: C?#40.2 Q?#39.1(C) R?#82.2 U?#14.2(IN+)
NetC?#41_2: C?#41.2 R?#90.1 U?#13.1(IN-) U?#14.1(IN-)
NetC?#42_2: C?#42.2 R?#89.1
NetC?#43_2: C?#43.2 R?#91.1
NetC?#44_2: C?#44.2 Q?#41.1(C) R?#97.2 U?#15.2(IN+)
NetC?#45_2: C?#45.2 D?#28.2(K) R?#94.2
NetC?#46_2: C?#46.2 R?#103.1 U?#15.1(IN-) U?#16.1(IN-)
NetD?#1_1: D?#1.1(A) R?#1.2
NetD?#3_1: D?#3.1(A) Q?#3.2(B)
NetD?#5_1: D?#5.1(A) R?#9.2
NetD?#7_1: D?#7.1(A) Q?#8.2(B) R?#16.1
NetD?#7_2: D?#7.2(K) R?#14.2
NetD?#8_2: D?#8.2(K) Q?#5.2(B) Q?#8.1(C) R?#15.1
NetD?#10_1: D?#10.1(A) R?#20.2
NetD?#12_1: D?#12.1(A) Q?#14.2(B)
NetD?#12_2: D?#12.2(K) R?#26.2
NetD?#13_2: D?#13.2(K) Q?#14.1(C) R?#27.2 R?#28.1
NetD?#15_1: D?#15.1(A) Q?#16.1(G) R1#1.1 R?#34.1
NetD?#15_2: D?#15.2(K) R?#33.1
NetD?#16_1: D?#16.1(A) Q?#28.1(G) R?#39.1 R?#40.1
NetD?#16_2: D?#16.2(K) R?#38.1
NetD?#18_1: D?#18.1(A) R?#50.2
NetD?#20_1: D?#20.1(A) Q?#36.2(B)
NetD?#20_2: D?#20.2(K) R?#54.2
NetD?#21_2: D?#21.2(K) Q?#36.1(C) R?#55.2 R?#60.1
NetD?#25_1: D?#25.1(A) R?#73.2
NetD?#28_1: D?#28.1(A) Q?#40.2(B)
NetESR?#3_1: ESR?#3.1 ESR?#7.2 ESR?#8.2
NetESR?#4_1: ESR?#4.1 ESR?#5.1 ESR?#6.2
NetESR?#9_1: ESR?#9.1 ESR?#10.1 ESR?#12.2
NetESR?#11_1: ESR?#11.1 ESR?#13.2 ESR?#14.2
NetL?#4_1: L?#4.1 Q?#16.2(S) Q?#18.3(D) R?#34.2
NetL?#5_1: L?#5.1 Q?#28.2(S) Q?#31.3(D) R?#40.2
NetQ2#2_1: Q2#2.1(C) R?#93.2 R?#97.1
NetQ2#2_2: Q2#2.2(B) R?#92.2 R?#95.1
NetQ?#1_1: Q?#1.1(C) R?#4.2 R?#8.1
NetQ?#1_2: Q?#1.2(B) R?#3.2 R?#6.1
NetQ?#3_1: Q?#3.1(C) R?#6.2
NetQ?#4_2: Q?#4.2(B) R?#7.2 R?#12.1
NetQ?#6_2: Q?#6.2(B) Q?#9.2(B) R?#13.2 U?#1.3(OUT)
NetQ?#6_3: Q?#6.3(E) Q?#9.3(E) R?#19.1
NetQ?#7_1: Q?#7.1(G) R?#19.2
NetQ?#10_2: Q?#10.2(B) R?#27.1
NetQ?#11_2: Q?#11.2(B) Q?#13.2(B)
NetQ?#11_3: Q?#11.3(E) Q?#12.1(G) Q?#13.3(E)
NetQ?#15_3: Q?#15.3(E) Q?#17.3(E) R1#1.2 R?#33.2
NetQ?#19_1: Q?#19.1(C) Q?#24.1(C)
NetQ?#20_1: Q?#20.1(C) Q?#25.1(C)
NetQ?#21_3: Q?#21.3(E) Q?#23.3(E)
NetQ?#22_1: Q?#22.1(C) Q?#26.1(C)
NetQ?#27_3: Q?#27.3(E) Q?#29.3(E) R?#38.2 R?#39.2
NetQ?#32_2: Q?#32.2(B) R?#55.1
NetQ?#33_2: Q?#33.2(B) Q?#35.2(B) R?#53.2 U?#7.3(OUT)
NetQ?#33_3: Q?#33.3(E) Q?#35.3(E) R?#63.1
NetQ?#34_1: Q?#34.1(G) R?#63.2
NetQ?#39_2: Q?#39.2(B) R?#83.2 R?#86.1
NetQ?#40_1: Q?#40.1(C) R?#95.2
NetQ?#41_2: Q?#41.2(B) R?#96.2 R?#98.1
NetR1#2_1: R1#2.1 R2.2 R3.2 U?#4.2(IN+)
NetR3_1: R3.1 R4#2.2 R5.1 U?#4.3(OUT)
NetR?#1_1: R?#1.1 R?#2.2
NetR?#9_1: R?#9.1 R?#10.2
NetR?#17_1: R?#17.1 R?#18.1 R?#25.2 U?#2.3(OUT)
NetR?#18_2: R?#18.2 R?#23.1 R?#24.2 U?#2.2(IN+)
NetR?#20_1: R?#20.1 R?#21.2
NetR?#29_1: R?#29.1 U??.2(K)
NetR?#30_1: R?#30.1 R?#32.2 U??.1(R)
NetR?#41_2: R?#41.2 R?#44.2 U?#6.2(IN+)
NetR?#42_1: R?#42.1 R?#43.1 R?#49.2 U?#5.3(OUT)
NetR?#43_2: R?#43.2 R?#45.1 R?#48.2 U?#5.2(IN+)
NetR?#50_1: R?#50.1 R?#51.2
NetR?#52_2: R?#52.2 R?#57.2 U?#7.2(IN+)
NetR?#56_1: R?#56.1 R?#58.1 R?#62.2 U?#8.3(OUT)
NetR?#58_2: R?#58.2 R?#59.1 R?#61.2 U?#8.2(IN+)
NetR?#66_2: R?#66.2 R?#68.2 U?#9.2(IN+)
NetR?#67_1: R?#67.1 R?#69.1 R?#72.2 U?#10.3(OUT)
NetR?#69_2: R?#69.2 R?#70.1 R?#71.2 U?#10.2(IN+)
NetR?#73_1: R?#73.1 R?#74.2
NetR?#76_1: R?#76.1 R?#77.1 R?#81.2 U?#11.3(OUT)
NetR?#77_2: R?#77.2 R?#79.1 R?#80.2 U?#11.2(IN+)
NetR?#84_1: R?#84.1 R?#85.1 R?#90.2 U?#13.3(OUT)
NetR?#85_2: R?#85.2 R?#87.1 R?#88.2 U?#13.2(IN+)
NetR?#99_1: R?#99.1 R?#100.1 R?#103.2 U?#16.3(OUT)
NetR?#100_2: R?#100.2 R?#101.1 R?#102.2 U?#16.2(IN+)

Not connected (* = marked no-connect by the designer): C?#20 1 2; C?#21 1 2; C?#22 1 2; C?#23 1 2; C?#25 1 2; C?#29 1 2; C?#30 1 2; C?#31 1 2; C?#32 1 2; Q2#1 1(C) 2(B) 3(E); Q?#2 1(G); Q?#15 2(B); Q?#17 2(B); Q?#18 1(G); Q?#19 2(B); Q?#20 2(B); Q?#21 2(B); Q?#22 2(B); Q?#23 2(B); Q?#24 2(B); Q?#25 2(B); Q?#26 2(B); Q?#27 2(B); Q?#29 2(B); Q?#30 1(G); Q?#31 1(G); Q?#37 1(G); Q?#38 1(G); U?#6 3(OUT); U?#9 3(OUT); U?#12 3(OUT); U?#14 3(OUT); U?#15 3(OUT)

## Notes on the sheet
- MPPT4开关电路
- 可以通过增力加PNP三极管来实现
- 芯片外部驱动电路
- PWM充放电电路
- 电压环设计
- +
- Q1
- 输入电压
- Vin
- -
- 电源处理电路
- 输出电压
- 负载
- 开关驱动
- 电流、电压
- (near C?#1) PWM
- 调制器
- 误差放大器
- 调制器补偿
- 当MOS管开通时，依旧让芯片进行直接驱动，但在关断时可以通过三极管来进行放电
- (near D?#4) Q2
- 限幅电压
- 基准电压
- 这时，三极管的be电流控制ec电流，进而泄放MOS管的栅极电容的电荷
- 当三极管的ce电流满足一定条件时,ec的电流能够通过be电流进行放大，这样电源IC所需的关断能力就会小很多
- 这不仅加快了MOS管关断速度慢的问题，同时也解决了IC驱动能力不足的问题
- (near U?#1) 直流电平
- 通信协议/信号
- 保护、状态监测、通信
- (near U?#1) 三角波
- (near C?#5) 自举电容
- (near Q?#7) Q1
- 双阈值电路设计
- (near D?#7) 低阈值
- (near D?#8) 高阈值
- 辅助电源设计
- 栅极电阻大小是如何改变振荡波形的
- 升降压启动后，由电路输出给辅助电源12V供电
- 输出接入完成后，断开辅助供电电源
- mos管是电压控制器件,与双极性三极管不同的是，mos管的导通只需要控制栅极的电压超过其开启阈值电压即可，不需要栅极电流
- 所以本质上，MOS管棚极上无需串联任何电阻
- 对于普通的双极性三极管，它是电流控制器件
- (near Q?#10) 双阈值电路
- (near D?#9) Q2
- 输入最大电压：
- 32V
- 采用降压拓扑
- BUCK
- 15V
- 由输出电压提供
- EXTVCC
- 输出电压建立后断开ENTVCC
- 它的基极串联电阻是为了限制基极电流的大小
- 否则对于驱动信号源来说，三极管的基极对地之间就等效成一个二极管，会对前面驱动电路造成影响
- 而MOS管，由于它的棚极相对于漏极和源极是绝缘的，所以棚极上无需串联电阻进行限流
- 采用升压拓扑
- 由输入电压供电
- LDO:15V—12V
- ENTVCC
- 负偏移，同相衰减器运放供电（LM324）
- 预驱电路（IR2106）
- 功率部分供电
- 12V(LDO)
- 信号级产生基准电压
- 5V(LDO)
- 使用LM340架构
- 单片机供电
- 3.3V(LDO)
- 相反，考虑到MOS管棚极存在的寄生电容
- 为了加快MOS管导通和截止的速度，降低MOS管在导通和截止过程中的损耗，它的棚极上的等效电阻应该越小越好
- 可是很多实际MOS管电路中，在MOS管栅极上所串联的电阻几乎无处不在，似乎大家都忘记了
- (near Q?#12) Q1
- 输入最小电压：
- 5V
- BOOST
- 使用uA7805架构去做
- 这个电阻存在会延长MOS导通和截止的时间，增加无谓的损耗
- 那为什么有些电路上还要在MOS管的棚极前放这个电阻呢，它到底有什么作用?
- 首先要明确一个概念，模拟电路不是非o即1，而是一个连续变化的过程无论是电容上的电压还是电感上的电流，都不能突变，否则将产生灾难性的后果
- (near D?#12) 低阈值
- (near D?#13) 高阈值
- 问题一：输出电压为15V，为什么驱动LDO输出为12V
- 一般情况下预驱动电压范围在10-20V之间
- 通过仿真，我们发现，电阻越大，米勒平台时间延长了，但是上升波形更加平缓了
- 如果它的取值小了，就会引起输出振铃，如果大了就会增加MOS管的开关过渡时间，从而增加功耗
- 如果开关升降压电路的EXTVCC定为12V，则我后级LDO输出需要2V压降输出会变成10V
- 10V给MOS管供电的话他的Rdson比较大，功耗比较高
- 常规驱动电压一般选择12、15V，LDO输出至少需要2V的压降
- (near D?#14) Q2
- 本质是我们设计的12V和5V的LDO不是低压差的
- 所以我内部是使用12VLDO，则输出是12V+2V以上
- 高阀值的设计目的是让其阀值高一点自举电容电放慢一点
- 自举电容电放慢就会导致输出更容易起来
- 问题二：输出为15V，输入最大电压和最小电压如何选择
- 假设我的输入是100V，输出为15V，这占空比为15%
- 如果mos管选择的是慢管，比较小的占空比，开关频率比较高，有可能无法让Mos管完全导通
- 我们知道输入输出电压是通过占空比来确定，输入电压一定时，输出电压越小其占空比越小
- 设计的时候要想达到16V导通Q3
  上面这个电路有问题导通之后会有功耗
  Q3导通一瞬间自举电容能量会被抽掉
  自举电容电压一旦被抽掉之后不就导通不了Q
  就需要设计一个双阈值电路
  高阔值的设计目的是让其阔值高一点自举电容
  自举电容电放慢就会导致输出更容易起来
  低阔值就要考虑mos管的导通阔值不能太低了
  高阔值就设置在I6V低阀值就设置在8V
- 低阈值就要考虑mos管的导通阀值不能太低了
- 高阀值就设置在16V低阀值就设置在8V
- 16V
- 自举电容
- 最大占空比限制
- 自举电容的充放电波形
- 8V
- 自举电容电下降说明前极驱动开始工作了，工作时抽取电容能量
- 驱动极的控制信号是由Vcc提供的
- Vcc又是由自举电容提供
- MOS管控制方波
- MOS管驱动电路设计
- 自举电容的电压在下降是不是PWM的幅值也在下降
- 比较器生成PWM电路
- (near Q?#16) Q1
- VCC >  VREF时，Vout  = VCC
- VCC <  VREF时，Vout  = GND
- 三角波形需要的条件：
- (near Q?#18) Q2
- （1）不能太缓慢
- （2）电压不能太低
- (near C?#12) 0V
- (near C?#13) 0V
- 20V
- 电容只有上升和下降中间的一段接近线性
- 去掉接近电源2/3处和接近地的1/3处
- 问题一：为什么使用上N下P的三极管结构，为什么不使用其他结构
- MOS管GS电阻的作用
- 上N下P
- 下N上P
- 都是N管
- 都是P管
- MOS是电压驱动元件，对电压很敏感，悬空的G很容易接受外部干扰使MOS导通，外部干扰信号对G-S结电容充电，这个微小的电荷可以储存很长时间。
  在试验中G悬空很危险，很多就因为这样爆管，G接个下拉电阻对地，旁路干扰信号就不会直通了，一般可以10~20K。这个电阻称为栅极电阻
- (near ESR?#5) 2/3Vcc
- (near ESR?#8) 1/3Vcc
- 作用1：为场效应管提供偏置电压；
  作用2：起到泻放电阻的作用(保护栅极G~源极S)；
- 自行分析一下
- 解释一下第二个作用的原理。保护栅极G~源极S，场效应管的G-S极间的电阻值是很大的，
  这样只要有少量的静电就能使他的G-S极间的等效电容两端产生很高的电压，
  如果不及时把这些少量的静电泻放掉，他两端的高压就有可能使场效应管产生误动作，
  甚至有可能击穿其G-S极。这时栅极与源极之间加的电阻就能把上述的静电泻放掉，从而起到了保护场效应管的作用
- 当正输入大于负输入时，比较器输出高电压VCC
- 充电
- 当正输入小于负输入时，比较器输出高电压VCC
- 放电
- MOS管的驱动极电路都是低压差电路，当MOS管导通时，源极电压约等于漏极电压100V
- 如何控制主回路NMOS管开关
- (near ESR?#10) 2/3Vcc
- (near ESR?#14) 1/3Vcc
- 节点A的电压是在变化的（100V、-0.7V）MOS管的驱动极电路相当于一条船，都是在节点A上浮动的
- 我可以把mos管的s极看成是前面所有驱动极的地
- 如果要完整打开MOS管，栅极电压要大于源极电压，则需要产生比输入更高的电压
- 肯定不可以因为Vbus是高压的
- 当mos管导通后驱动极电路是站在Vbus上面的
- 相对于mos管的驱动极来说这个地就是浮地驱动极需要供电，可以直接用Vbus供电吗？
- RC形成三角波
- 正输入端电阻等效电路
- 比较器输出端电容等效电路
- (near Q?#28) Q1
- (near C?#17) 自举电容
- (near C?#17) PWM
- 节点A
- (near Q?#30) Q1
- (near D?#17) Q2
- (near D?#17) 100V
- (near Q?#31) Q2
- (near C?#20) 112V
- 直流电平
- (near C?#25) 压差12V
- (near C?#25) 12V
- (near C?#21) 100V
- MOS管驱动电阻对开关损耗，电磁干扰，效率和可靠性分析
- (near C?#25) 0V
- (near C?#25) 一旦mos管导通了，驱动极都是由电容供电
- (near C?#25) 电容两端的压差就是GS的压差
- MOS管采用“慢开快关”的原则是为了降低开关损耗
- 减少电磁干扰，并提高电路的效率和可靠性
- 慢开(Slow Turn-on)的原因：
- 只要电容电足够大就能够对mos管实现正常的开关
- 节点A的沿陡与缓对我电容上的压差关系不大
- 随着我电压上升我自举电容上的电压也在上升
- 压差不变但是对地的绝对电压在上升
- 1-降低电流变化率(di/dt):慢开可以减少MOSFET在导通时的电流变化率，从而降低尖峰电压，保护MOSFET不受损坏
- 2-减少电磁干扰(EMI)︰快速导通会导致电流和电压的快速变化，产生高频谐波，增加电磁干扰
- 3-控制开关损耗:虽然慢开会增加导通损耗，但在低频应用中，这种损耗是可以接受的
- 慢开使电流变化更平滑，降低高频辐射，减少对周围电路的干扰
- 1-减少关断损耗:快关可以显著减少MOSFET在关断时的能量损耗
- 快关(Fast Turn-Off)的原因：
- 自举电容比喻
- 3-提高效率:在高频开关应用中，快关能够有效降低能量损耗，提升整体电路效率，尤其是在开关频率较高的场合
- 2-避免误导通:快速关断可以防止MOSFET在关断过程中误导通，从而提高电路的可靠性
- 关断时，MOSFET的Vds上升，Id下降，如果关的慢，损耗时间会延长，导致总损耗增加，发热加剧
- 自举电容就类似一艘船，随着水平面上升
- 水涨船高
- 虽然“慢开快关”是理想的设计原则，但在实际应用中需要权衡开关速度
- 慢开过慢会增加导通损耗，尤其在高频应用中，损耗累积会导致效率下降和发热
- 因此，设计时需要根据具体应用场景优化开关速度，以平衡效率和可靠性
- 实际设计中的权衡：
- (near C?#26) 自举电容
- (near Q?#34) Q1
- 通过控制栅极电阻和电容的充放电特性，可以实现对开关速度的调节，从而在保证安全的同时提升电路性能
- 低阈值
- (near D?#21) 高阈值
- MOS驱动电阻对开关性能的影响分析
- —、驱动电阻的作用机制
- MOSFET的栅极控制回路本质上可以看作是一个RC充放电电路
- 由于MOS管的栅极存在一定的输入电容(主要包括Cgs、Cgd等)
- (near C?#29) GS压差
- (near C?#29) 12V
- (near D?#22) Q2
- 在驱动器输出信号加载至栅极时，需要一定时间将电容充电至开启电压
- 同样，在关断时也需将电荷释放
- 因此，驱动电阻在这里起着限制电流、调节充放电速度、控制dvldt与di/dt的关键作用
- (near C?#30) GS压差
- (near C?#30) 12V
- 二、电阻大小对开关速度的影响
- 驱动电阻越小，栅极电容充放电的时间越短，MOSFET开通与关断的速度也随之提升
- 0V
- mos管稳态波形分析
- 这在高频切换应用中显得尤为重要，有助于减少导通/关断重叠区间，从而降低开关损耗
- 然而，电阻值过低也并非最佳方案
- 过快的开关速度可能导致电压或电流的尖峰，诱发栅极震荡、振铃甚至EMI增强问题
- 特别是在具有较大寄生电感的布局中，过小的驱动电阻反而可能引起MOSFET的误动作或热击穿风险
- (near C?#31) GS压差
- 后级电路未正常工作波形
- 三、对开关损耗的调节能力
- MOSFET的开关损耗主要发生在状态转换的瞬间，即电流尚未完全为零时，漏极电压已开始上升，或反之
- (near C?#32) GS压差
- (near C?#31) 12V
- 高阈值
- 区间1
- 区间2
- 区间3
- 区间4
- 后级电路正常工作波形
- 在这个过程中，MOS管同时承受较高的电压与电流，因此能耗集中
- 合适的驱动电阻可以将这个过渡时间压缩到最短，从而大幅度减少瞬态能耗
- 例如在大功率DC-DC转换器中，合理的Rgate选择可以让转换效率提高3%~7%，对整体热设计与散热方案产生积极影响
- (near C?#32) 12V
- 自举电容电压
- 12V
- 四、驱动电阻与EMI及系统稳定性的关系
- 开关速度过快虽然有助于降低损耗，但也意味着更高的dv/dt与di/dt速率
- 这极易激发电路中的寄生电感与电容，从而形成高频噪声，导致EMI增加，影响邻近电路的正常工作
- 为此，工程师常通过适当增大驱动电阻来延缓开关沿，降低高频干扰
- 在多MOS并联应用或桥式拓扑中，这种调节还可避免因器件不一致而造成的不均流现象，提高系统整体稳定性
- 自举电容后级PWM供电电压
- 双稳态控制电路
- 五、电阻选值的工程实践建议
- 在实际设计中，驱动电阻的选值通常不只依据理论计算
- 而是需要根据电路结构、MOSFET封装、布线长度、工作频率和驱动芯片能力等因素综合考量
- 一个常见的经验公式如下:
- Rgate ≈ Tr /(Qg / Vdrive)
- 三角波与直流电平相切
- 其中，Tr是目标上升时间，Qg为总栅电荷，Vdrive是驱动电压
- 通常还会采用分段驱动方式，即在驱动路径上串联两个不同阻值的电阻，分别控制上升沿与下降沿
- 或使用带有反向二极管的网络结构，实现更细腻的动态调节
- 推挽电路输出
- 六、真实案例分享
- 在某工业级电动机控制项目中，起初将MOSFET的驱动电阻设为4.72
- 观察到MOs管在高载波频率下存在过热情况
- 如果后级电压升不上去就会打隔（能量不够）
- 比如说我在区间2最后一刻后级电压建立起来了
- 经示波器测试发现导通斜率过快，漏极振铃严重
- 随后将电阻调至10Q，并在栅极并联RC缓冲网络，有效抑制了震荡
- MOS温升下降了约15%，整机运行稳定，长期测试无异常发生
- (near C?#33) 自举电容
- (near Q?#37) Q1
- 必须让在区间2将后级电路工作起来
- 那么自举电容上的电压波形应该是什么样子的
- 如果后级电路电压建立起来了就由D2二极管开始供电
- 当Vout电压大于等于你的低阈值（8.3V）的时候就由电感来供电了
- (near C?#33) PWM
- MOSFET作为开关器件，在驱动电路中主要用于控制电流的通断，比如在DC-DC转换器、电机驱动或者功率放大电路中
- MOS驱动“慢开快关”原则
- (near D?#24) Q2
- PWM软启动电路设计
- 它的开关过程(开和关)会直接影响电路的效率、发热和可靠性
- MOSFET的开关过程中开和关的本质是什么呢?
- MOSFET的开关过程主要由栅极电压Vgs控制
- 方波产生电路
- 三角波和直流电平相切
- Turn-On时，栅极电压Vgs从0V上升到阈值电压Vth以上，MOSFET开始导通
- 漏极到源极的电阻RDS(on)迅速减小,电流开始流过
- Turn-Off时，栅极电压Vgs从高电平下降到低于Vth，MOSFET截止，漏极到源极变成高阻态，电流被阻断
- 开关过程并不是瞬间完成的，MOSFET的栅极有一个等效电容
- 要搭建电容的充电回路
- 分析电路
- 1）初始上电阶段
- 2）稳态工作阶段（最好分析）
- 包括栅极-源极电容Cgs和棚极-漏极电容Cgd，统称为输入电容Cis
- 驱动电路需要通过栅极电阻Rg给这个电容充放电，充放电速度直接决定了开关速度
- 3）掉电过程
- 初始上电，直流电平快速上升，并且超过三角波，比较器输出高电平，MOS管打开
- 稳态工作状态如何对电容进行充电
- 稳态MOS管在ON期间节点A已经是100V了
- 在ON期间有没有办法对电容充电
- 对电容充电我需要找电压源
- 希望刚上电时候，直流电平的上升速度小于三角波
- 如果三角波形成时间较长，则电感容易饱和，烧毁
- MOS管打开后，电感开始快速充电，这个时候若干个周期都出现了100%占空比
- 电压源只有两个一个是Vo输出一个是Vbus
- 要想在ON期间对自举电容充电就需要电容正极是112
- 电压源没有办法考虑了是不是可以找电流源
- "慢开"指的是MOSFET从截止到导通的过程可以稍微慢一点，也就是让VGS上升得慢一些
- 为什么MOS管可以慢开?
- 电感只有在续流期间才是电流源
- 只有在OFF期间电感才能续流
- 当MOSFET导通时，漏极电流ID会迅速上升，di/dt很大
- 这主要是为了减少开关过程中的电磁干扰EMI和电压尖峰
- 降低di/dt，减少寄生电感引起的电压尖峰:
- 我们看到自举电容的负端接到了电感的左端
- 自举电容的充电电流能够流到电感的负极
- 我只要把电感的正极引到自举电容正极就能构成回路
- 电感对一个电容充电你只有并联才行（还要站在同一个点上）
- 给三角波电容充电的时间就是23k*1nF=23us（定性）
- 要想三角波电容上面有一定抗干扰能力和带载能力就需要R小C大
- 1k*1nF=lus
- 直流电平要像上图一样缓慢上升并且趋于稳定，这里面至少要包含几十个周期
- 根据电感电压公式V=L*di/dt，di/dt越大，寄生电感上产生的电压尖峰就越大
- 当MOSFET导通时，漏极电流ID会迅速上升
- di/dt很大电路中不可避免地存在寄生电感，比如PCB走线、引脚电感等
- 此时自举电容与电感续流期间都站在二极管的负端
- 我们的三角波充电慢放电快
- 实际上你还要去掉一个低1/3还要去掉一个顶2/3那就是小于23us
- 65khz=15.38us和估算的小于23us差不多
- 三角波的频率等于开关频率
- 不管开关频率是10K、50K、100K，都要你直流电平缓慢上升
- 直流电平缓慢上升代表的是一个软启的过程
- 对于三角波来说是一个RC（t1）
- 这个尖峰可能叠加到MOSFET的漏极-源极电压Vds上，严重时可能超过MOSFET的耐压,导致击穿
- 我们所有的设计都是依据设计的底层逻辑与考虑的对象
- 由于这里给三角波供电的是自举电容所以就需要精打细算
- 保证直流电平t2要远远大于三角波t1
- 对于直流电平来说也可以使用RC（t2）进行软启动
- 在三角波形成后，直流电平接近三角波，这样避免100%的占空比产生
- 做延时电路的几个要素：
- (near C?#36) 自举电容
- (near C?#36) PWM
- (near Q?#38) Q1
- 斜率包含两个信息，第一个是幅值阀值电压，第二是延时时间
- 要做斜率一定要做RC延时，再做一个阈值就产生了延时时间
- RC（斜率）+V（阀值）=时间
- 为什么MOS管可以快关？
- MOS管开通和关断的过程，就是MOS管栅极电容充电和放电的过程
- 当没有二极管D和电阻Rs_off时，开通时充电和关断时放电的串联电阻都是Rs_on，二者是一样的
- 也就是说我要在三极管Q4的基极上我要看到RC与阀值
- 当要开通MOS时，驱动器输出驱动电压Vg_drive
- 此后一直到MOS管完全开通，Vg_drive都大于MOS的栅极电压，此时二极管不导通
- 所以，相当于Vg_drvie通过电阻Rs_on给栅极进行充电
- (near D?#27) Q2
- (near U?#12) 直流电平
- 我们也可以看出，加不加这个Rs_off和二极管D，对于MOS管的开通速度是没有影响的
- 当要关断MOS时，Vg drive接GND，栅极电压大于Vg_drive，因此二极管导通
- 相当于栅极通过Rs_ off并联Rs_ on进行放电(严格来说，这里面还有一个二极管的导通压降，并不是很严;
- 因此，放电时的等效串联电阻为Rs_offIRs_on，要小于开通时的串联电阻Rs_on
- (near U?#12) RC形成三角波
- 而电阻越小，充放电速度越快，因此我们说，加上这个Rs_off和二极管D可以加速关断
- 回到我们最开始的问题，为什么我们要专门增加二极管让关断更快一点呢?
- 这是因为如果电阻一样的话，关断本身耗时就会长一点
- 自举电容初始上电如何充电
- 自举电容充电期间电感会不会饱和？
- 因为有限流电阻（R1R2）电感就不会饱和
- 那为什么关断时间会更长?明明充放电的电阻阻值一样?
- 限流电阻大初始上电慢一点，工作之后主要靠电感电流给他充电
- 从功耗角度来说R要取大，我最终只希望给自举电容流过1mA的电流
- 自举电容充电期间不希望电流给驱动极供电
- 否则充电电流更小启动时间更长
- PWM直流电平幅值限制电路设计
- 我希望初始上电的时候把驱动极断掉只给自举电容充电
- 方案一：使用三极管
- 导通阶段：栅极从门限电压Vgs充电到米勒平台Vgp的时间
- 断开阶段：栅极从米勒平台Vgp充电到门限电压Vgs的时间
- 我们发现这个米勒效应的电压是在一个较低的电压触发的
- 同时我们将栅极和源极之间的导通类比成了给电容充放电
- 导通和断开是互逆的过程
- 为了限制直流电平不能超过三角波的最高电平，防止100%的PWM占空比产生
- C2电容电压超过三极管基级电压时，三极管导通，将三极管集电极电压钳位
- (near U?#14) 直流电平
- 设计电路能用无源器件就坚决不用有源器件
- 由于三极管发射极没有电阻，导通后类似与导线，将电容电流放电
- 如果用稳压管，稳压管的偏差比较大，放到三角波里面不合适
- (near C?#42) 0V
- (near C?#43) 0V
- (near U?#14) RC形成三角波
- 导通模型
- 关断模型
- 驱动电压Vg_drive
- 米勒平台电压Vgp
- 门限电压Vgs
- PWM直流电平启动电路设计
- 可以看到，充电时，电压开始上升很快，后面越来越慢，而放电时，也是开始很快，后面很慢
- 比如以TI的NMOS为例: Vgs(th)=1.3V, Vgp=2.5V
- 而一般MOs的Vgs_th也就2V左右，Vgp也就比Vgs_th高1~2V左右
- 如果直流电平启动时间都大于自举电容从16V掉到欠压（8V）了这个电路肯定跑不起来
- 直流电平最缓慢的这段时间要远远小于自举电容从16V掉到欠压（8V）的时间
- 直流电平最缓慢的这段时间也不能太短，否则三角波还没起来直流电平第二段就与三角波相切了
- 后级电路的正常工作需要多个PWM才能正常工作起来
- 如果在自举电容第一个周期内，后级电路没有稳定工作，则会出现打嗝
- 所以需要在直流电平软启动到某个电压，然后转换成更快的充电斜率，让PWM更快工作起来
- 这样就满足了前期启动电路直流电平小于三角波，同时提升后期PWM调整的瞬态响应时间
- (near Q2#1) 延时2开启 > 延时1开启
- (near Q2#1) Q2为什么要使用P管，不使用N管？
- 开通过程中对栅极进行充电，Vgs_th和Vgp相对于充电初始电压OV比较近
- 同时会与后级形成形成恒流源，电容充电电流被限制
- 如果使用N管，发射级会与后面的电路形成负反馈，使三极管处于放大区间
- 因此处于充电曲线的前期阶段，充电会比较快，耗时会比较短
- 而关断过程中对栅极放电，Vgs_th和Vgp相对于放电初始电压Vg_drvie比较远
- 因此处于充电曲线的较后期阶段，放电比较慢，耗时会比较长
- 为什么使用延时启动，不使用双阈值电压判断来处理？
- (near U?#15) 直流电平
- (near U?#15) 三角波

## Library data of the parts
C?#2-C?#4 C?#6-C?#8 C?#10 C?#11 C?#14-C?#16 C?#18 C?#19 C?#24 C?#27 C?#28 C?#34 C?#35 C?#37-C?#46 = Capacitor: SimulationGenericComponent: True
C?#12 C?#13 = Capacitor: SimulationGenericComponent: True; Value: 10uF
D?#1-D?#28 = 1N4148W_C7420318: Symbol: 1N4148W_C7420318
ESR?#1-ESR?#14 R1#1 R1#2 R2 R3 R5 R?#3-R?#8 R?#12 R?#13 R?#17-R?#19 R?#23 R?#24 R?#29 R?#30 R?#32-R?#34 R?#36 R?#38-R?#45 R?#48 R?#52 R?#53 R?#56-R?#59 R?#61 R?#63 R?#66-R?#71 R?#73-R?#77 R?#79 R?#80 R?#82-R?#89 R?#91-R?#102 = Resistor: TC1: 0; SimulationGenericComponent: True; TC2: 0
L?#1-L?#9 = Inductor: SimulationGenericComponent: True
Q2#1 Q2#2 Q?#1 Q?#5 Q?#9 Q?#10 Q?#13 Q?#17 Q?#19 Q?#20 Q?#22 Q?#23 Q?#29 Q?#32 Q?#35 = BJT PNP GP: BF: 100; AF: 0; BR: 1; EG: 1.11; FC: 0.5; IS: 1e-16; MJC: 0.33; NC: 2; NE: 1.5; TNOM: 27; VBC_MAX: 1e99; VJC: 0.75; XTI: 3; SimulationGenericComponent: True; CJC: 0; CJE: 0; CJS: 0; CTC: 0; CTE: 0; CTS: 0; IKF: 0; IKR: 0; IRB: 0; ISC: 0; ISE: 0; ISS: 0; ITF: 0; KF: 0; MJE: 0.33; MJS: 0; NF: 1; NKF: 0.5; NR: 1; NS: 1; PTF: 0; RB: 0; RBM: 0; RC: 0; RE: 0; SUBS: 1; TBF1: 0; TBF2: 0; TBR1: 0; TBR2: 0; TF: 0; TIKF1: 0; TIKF2: 0; TIKR1: 0; TIKR2: 0; TIRB1: 0; TIRB2: 0; TIS1: 0; TIS2: 0; TISC1: 0; TISC2: 0; TISE1: 0; TISE2: 0; TITF1: 0; TITF2: 0; TLEV: 0; TLEVC: 0; TMJC1: 0; TMJC2: 0; TMJE1: 0; TMJE2: 0; TMJS1: 0; TMJS2: 0; TNC1: 0; TNC2: 0; TNE1: 0; TNE2: 0; TNF1: 0; TNF2: 0; TNR1: 0; TNR2: 0; TNS1: 0; TNS2: 0; TR: 0; TRB1: 0; TRB2: 0; TRC1: 0; TRC2: 0; TRE1: 0; TRE2: 0; TRM1: 0; TRM2: 0; TTF1: 0; TTF2: 0; TTR1: 0; TTR2: 0; TVAF1: 0; TVAF2: 0; TVAR1: 0; TVAR2: 0; TVJC: 0; TVJE: 0; TVJS: 0; VAF: 0; VAR: 0; VBE_MAX: 1e99; VCE_MAX: 1e99; VJE: 0.75; VJS: 0.75; VTF: 0; XCJC: 1; XTB: 0; XTF: 0
Q?#3 Q?#4 Q?#6 Q?#8 Q?#11 Q?#14 Q?#15 Q?#21 Q?#24-Q?#27 Q?#33 Q?#36 Q?#39-Q?#41 = BJT NPN VBIC: SimulationGenericComponent: True; AFN: 1; AJC: -0.5; ART: 0.1; AVC1: 0; EA: 1.12; FC: 0.9; IBBE: 1e-06; IBCI: 1e-16; IBEI: 1e-18; MC: 0.33; NCN: 2; NKF: 0.5; PC: 0.75; TNOM: 27; VERS: 1.2; XII: 3; AJE: -0.5; AJS: -0.5; AVC2: 0; BFN: 1; CBCO: 0; CBEO: 0; CCSO: 0; CJC: 0; CJCP: 0; CJE: 0; CJEP: 0; CTH: 0; DEAR: 0; EAIC: 1.12; EAIE: 1.12; EAIS: 1.12; EANC: 1.12; EANE: 1.12; EANS: 1.12; EAP: 1.12; EBBE: 0; GAMM: 0; HRCF: 1; IBCIP: 0; IBCN: 0; IBCNP: 0; IBEIP: 0; IBEN: 0; IBENP: 0; IKF: 0; IKP: 0; IKR: 0; IS: 1e-16; ISP: 0; ISRR: 1; ITF: 0; KFN: 0; ME: 0.33; MS: 0.33; NBBE: 1; NCI: 1; NCIP: 1; NCNP: 2; NEI: 1; NEN: 2; NF: 1; NFP: 1; NR: 1; PE: 0.75; PS: 0.75; QBM: 0; QCO: 0; QTF: 0; RBI: 0.1; RBP: 0.1; RBX: 0; RCI: 0.1; RCX: 0; RE: 0; RS: 0; RTH: 0; TAVC: 0; TD: 0; TF: 0; TNBBE: 0; TNF: 0; TR: 0; TVBBE1: 0; TVBBE2: 0; VBBE: 0; VEF: 0; VER: 0; VO: 0; VREF: 0; VRT: 0; VTF: 0; WBE: 1; WSP: 1; XIKF: 0; XIN: 3; XIS: 3; XISR: 0; XRBI: 0; XRBP: 0; XRBX: 0; XRCI: 0; XRCX: 0; XRE: 0; XRS: 0; XTF: 0; XVO: 0
R4#1 R?#37 = Resistor: TC1: 0; SimulationGenericComponent: True; Value: 10K; TC2: 0
R4#2 R?#1 R?#2 R?#9 R?#10 R?#14-R?#16 R?#20 R?#21 R?#25-R?#28 R?#49-R?#51 R?#54 R?#55 R?#60 R?#62 R?#72 R?#81 R?#90 R?#103 = Resistor: TC1: 0; SimulationGenericComponent: True; Value: 3.3K; TC2: 0
R?#11 R?#22 R?#31 R?#35 R?#46 R?#47 R?#64 R?#65 R?#78 = 3296W-1-103_C48997937: Symbol: 3296W-1-103_C48997937
U?#1-U?#16 = OpAmp: SimulationGenericComponent: True
U?? = tl431a_c54830631: 输出类型:可调;工作电压:2.5V~36V;输出电压:2.5V~36V;输出电流:150mA;精度:±0.5%;; Manufacturer: R+O(宏嘉诚); ManufacturerPart: TL431A; AddInBom: yes; ModelId: 89cb27a44ab2466697082bb9fd73a7d0; ModelName: SOT-23-3L_L2.9-W1.6-H1.1-LS2.8-P0.95; ModelTransform: 114.173,110.236,0,90,0,0,0,0,0; Output Type: 可调; Output Current: 150mA; Tolerance: ±0.5%; Reference Type: 并联; Quiescent Current: 1uA; Minimum Cathode Current for Regulation: 250uA; Symbol: TL431A_C54830631; LCSC Part Name: TL431A; SupplierPart: C54830631; Supplier Footprint: SOT-23; JLCPCB Part Class: Extended Part; Datasheet: https://item.szlcsc.com/datasheet/TL431A/58308643.html; Supplier: LCSC; ConvertToPcb: yes; FootprintName: SOT-23-3_L3.0-W1.7-P0.95-LS2.9-BR; Voltage - Supply: 2.5V~36V; Output Voltage: 2.5V~36V; Temperature Coefficient: -; Noise - 1/10Hz to 10Hz: -; Noise - 10Hz to 10kHz: -; Operating Temperature: -20℃~+70℃@(Ta)
C?#1 C?#5 C?#9 C?#17 C?#20-C?#23 C?#25 C?#26 C?#29-C?#33 C?#36 = JVJ50V100M6X8: Symbol: JVJ50V100M6X8
Q?#2 Q?#7 Q?#12 Q?#16 Q?#18 Q?#28 Q?#30 Q?#31 Q?#34 Q?#37 Q?#38 = 2N7002,215: Symbol: 2N7002,215